# EasyEDA Pro project ProPrj_浇水6代-v2_2026-10-01.epro

# Schematic 上板设计图
Board Name: 上板; Create Date: 2026-09-16; Page Name: P1; Project Name: New Project_2026-09-16_17-24-28; Schematic Name: 上板设计图; Update Date: 2026-09-22; Company: 嘉立创EDA; Page Size: A4; Version: V1.0
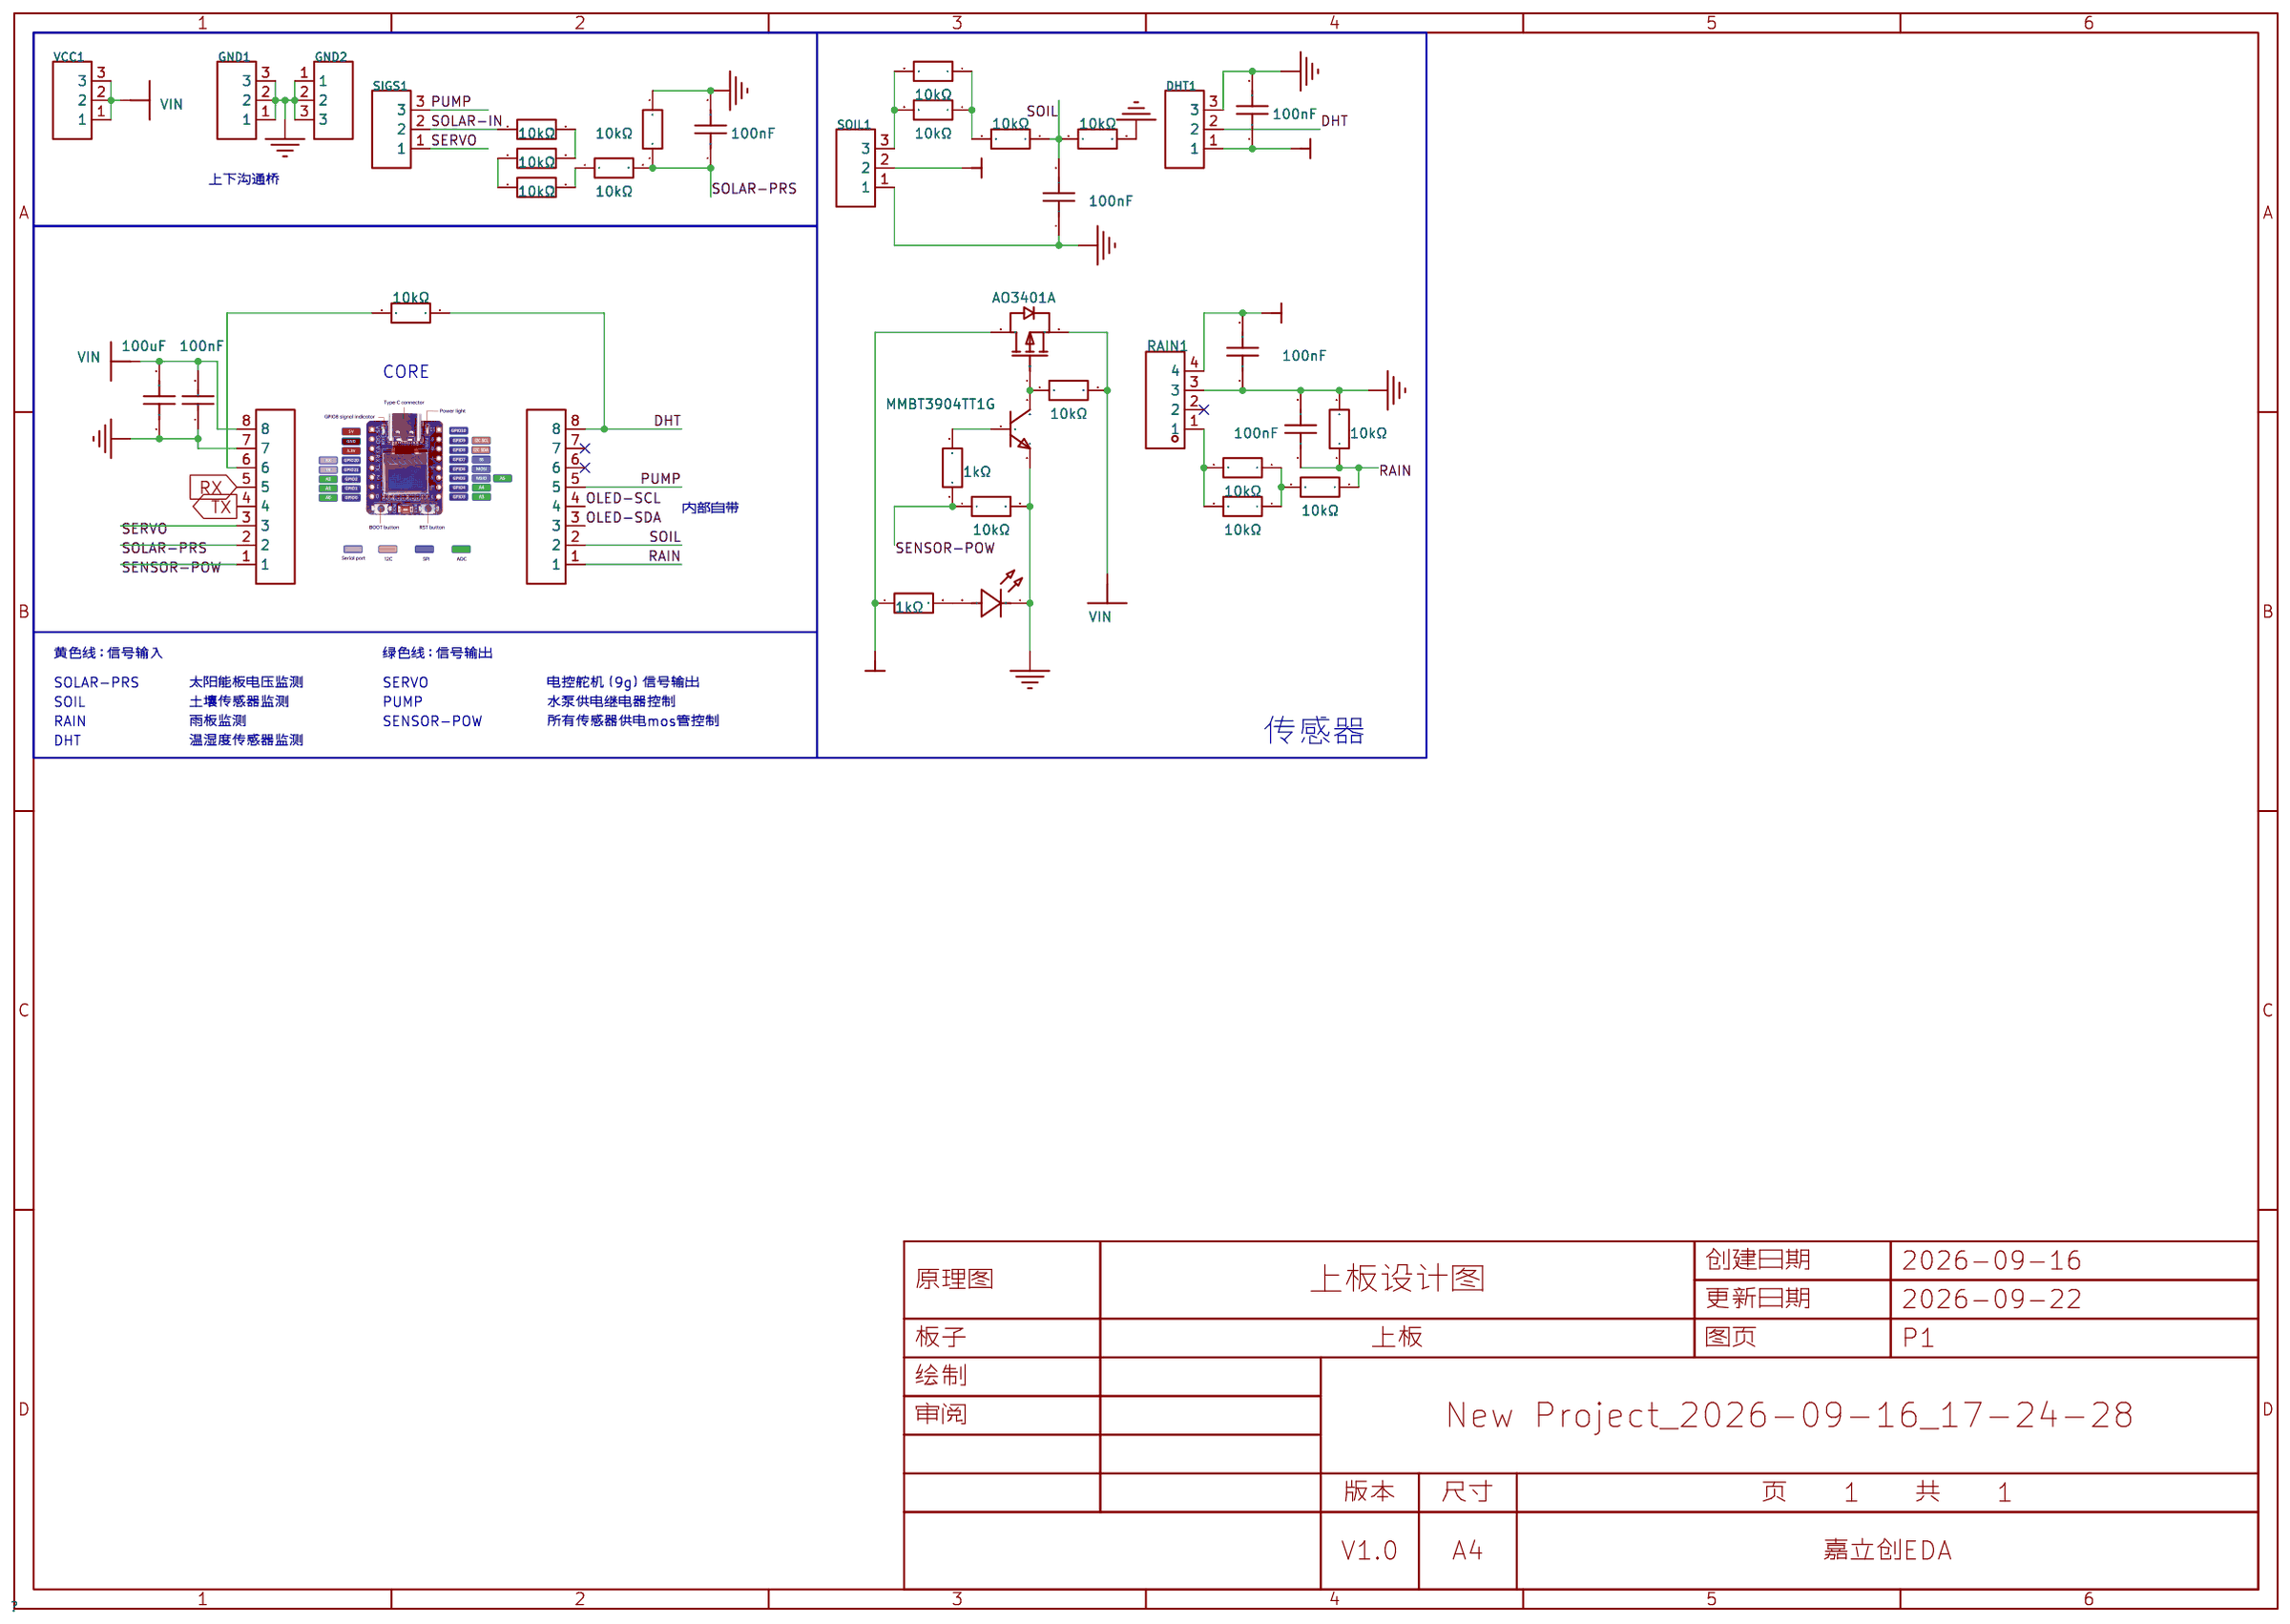
[diagram p0: schematic sheet]

## Parts
C1  100nF  [C0603]
C2  100nF  [C0603]
C28  2.54-1*8P母环保  [HDR-TH_8P-P2.54-V-F]
C29  2.54-1*8P母环保  [HDR-TH_8P-P2.54-V-F]
C31  100uF  [C1206]
C35  100nF  [C0603]
C36  100nF  [C0603]
C37  100nF  [C0603]
C38  100nF  [C0603]
DHT1  LAIL-PZ2.54-3P-L  [HDR-TH_3P-P2.54-V-M-1]
GND1  LAIL-PZ2.54-3P-L  [HDR-TH_3P-P2.54-V-M-1]
GND2  LAIL-PZ2.54-3P-L  [HDR-TH_3P-P2.54-V-M-1]
LED7  XL-2012UGC  [LED0805-RD_GREEN]
Q11  MMBT3904TT1G  [SC-75-3_L1.6-W0.8-P1.00-LS1.6-BR]
Q12  AO3401A  [SOT-23_L2.9-W1.3-P1.90-LS2.4-BR]
R1  1kΩ  [R0603]
R2  1kΩ  [R0603]
R49  10kΩ  [R0603]
R57  10kΩ  [R0603]
R61  10kΩ  [R0603]
R63  10kΩ  [R0603]
R64  10kΩ  [R0603]
R75  10kΩ  [R0603]
R78  10kΩ  [R0603]
R79  10kΩ  [R0603]
R80  10kΩ  [R0603]
R83  10kΩ  [R0603]
R84  10kΩ  [R0603]
R85  10kΩ  [R0603]
R86  10kΩ  [R0603]
R87  10kΩ  [R0603]
R89  10kΩ  [R0603]
R90  10kΩ  [R0603]
RAIN1  PM254-1-04-W-8.5  [HDR-TH_4P-P2.54-H-F-W10.0-N]
SIGS1  LAIL-PZ2.54-3P-L  [HDR-TH_3P-P2.54-V-M-1]
SOIL1  LAIL-PZ2.54-3P-L  [HDR-TH_3P-P2.54-V-M-1]
VCC1  LAIL-PZ2.54-3P-L  [HDR-TH_3P-P2.54-V-M-1]

## Library data of the parts
C1 = CL10B104KO8NNNC: LCSC Part Name: 100nF ±10% 16V; Supplier Part: C66501; Manufacturer: SAMSUNG(三星); Supplier Footprint: 0603; JLCPCB Part Class: Extended Part; Datasheet: https://item.szlcsc.com/datasheet/CL10B104KO8NNNC/67585.html; Supplier: LCSC; Tolerance: ±10%; Voltage Rating: 16V; Temperature Coefficient: X7R
C2 = CL10B104KB8NNNC: 容值:100nF;精度:±10%;额定电压:50V;温度系数:X7R;; LCSC Part Name: 100nF ±10% 50V; Supplier Part: C1591; Manufacturer: SAMSUNG(三星); Supplier Footprint: 0603; JLCPCB Part Class: 扩展库; Datasheet: https://item.szlcsc.com/datasheet/CL10B104KB8NNNC/1943.html; Supplier: LCSC; Tolerance: ±10%; Voltage Rating: 50V; Temperature Coefficient: X7R
C28 C29 = 2.54-1*8P母环保: LCSC Part Name: 1x8P 间距:2.54mm 直插; Supplier Part: C27438; Manufacturer: BOOMELE(博穆精密); Supplier Footprint: 插件,P=2.54mm; JLCPCB Part Class: 扩展库; Datasheet: https://item.szlcsc.com/datasheet/2.54-1*8P%25E6%25AF%258D%25E7%258E%25AF%25E4%25BF%259D/28187.html; Supplier: LCSC; Holes Structure: 1x8P; Pitch: 2.54mm; Circular Hole / Square Hole: 方孔; Mounting Type: 直插; Number of Rows: 单排; Number of Positions: 8P; Current Rating: 3A; Holes Direction: 顶部; Insulation Height: 8.5mm; Contact Material: 黄铜; Contact Plating: 金; Operating Temperature: -55℃~+105℃; PIN Length: 3.2mm
C31 = JMK316BJ107ML-T: LCSC Part Name: 100uF ±20% 6.3V; Supplier Part: C87164; Manufacturer: TAIYO YUDEN(太诱); Supplier Footprint: 1206; JLCPCB Part Class: Extended Part; Datasheet: https://atta.szlcsc.com/upload/public/pdf/source/20161110/1478747674498.pdf; Supplier: LCSC; Tolerance: ±20%; Voltage Rated: 6.3V; Temperature Coefficient: X5R
C35-C38 = CL10B104KB8NNNC: LCSC Part Name: 100nF ±10% 50V; Supplier Part: C1591; Manufacturer: SAMSUNG(三星); Supplier Footprint: 0603; JLCPCB Part Class: 扩展库; Datasheet: https://item.szlcsc.com/datasheet/CL10B104KB8NNNC/1943.html; Supplier: LCSC; Tolerance: ±10%; Voltage Rating: 50V; Temperature Coefficient: X7R
DHT1 GND1 SIGS1 SOIL1 VCC1 = LAIL-PZ2.54-3P-L: LCSC Part Name: 1x3P 间距:2.54mm 方针; Supplier Part: C54950604; Manufacturer: LAILAN(莱联); Supplier Footprint: 插件,P=2.54mm; JLCPCB Part Class: 扩展库; Datasheet: https://item.szlcsc.com/datasheet/LAIL-PZ2.54-3P-L/58519957.html; Supplier: LCSC; Pin Structure: 1x3P; Pitch: 2.54mm; Circluar Pins/Square Pins: 方针; Number of Rows: 单排; Number of Pins: 3P; Current Rating: 3A; Voltage Rating (Max): 250V; Insulation Height: 2.5mm; Length of End Connection Pin: 3mm; Contact Material: 黄铜; Contact Plating: 金; Operating Temperature: -25℃~+80℃; Color: 黑色
GND2 = LAIL-PZ2.54-3P-L: 插针结构:1x3P;间距:2.54mm;圆针/方针:方针;排数:单排;总PIN位数:3P;额定电流:3A;额定电压:250V;塑高:2.5mm;端接针长度:3mm;触头材质:黄铜;触头镀层:金;工作温度:-25℃~+80℃;颜色:黑色;; LCSC Part Name: 1x3P 间距:2.54mm 方针; Supplier Part: C54950604; Manufacturer: LAILAN(莱联); Supplier Footprint: 插件,P=2.54mm; JLCPCB Part Class: 扩展库; Datasheet: https://item.szlcsc.com/datasheet/LAIL-PZ2.54-3P-L/58519957.html; Supplier: LCSC; Pin Structure: 1x3P; Pitch: 2.54mm; Circluar Pins/Square Pins: 方针; Number of Rows: 单排; Number of Pins: 3P; Current Rating: 3A; Voltage Rating (Max): 250V; Insulation Height: 2.5mm; Length of End Connection Pin: 3mm; Contact Material: 黄铜; Contact Plating: 金; Operating Temperature: -25℃~+80℃; Color: 黑色
LED7 = XL-2012UGC: LCSC Part Name: 0805翠绿贴片式发光二极管; Supplier Part: C965815; Manufacturer: XINGLIGHT(成兴光); Supplier Footprint: 0805; JLCPCB Part Class: 扩展库; Datasheet: https://item.szlcsc.com/datasheet/XL-2012UGC/1051424.html; Supplier: LCSC; Lamp Holder Type: 2.0mmx1.2mm方形灯头; Illumination Color: 翠绿色; Voltage - Forward(Vf): 3.2V; Power(Watts): 70mW; Forward Current: 20mA; Wavelength - Dominant: 515nm~535nm; Peak Wavelength: 525nm; Diode Configuration: 独立二极管; Lens Color: 无色透明透镜; Luminous Intensity: 750mcd; Viewing Angle: 120°; Mounting Style: 正贴; Operating Temperature: -40℃~+85℃
Q11 = MMBT3904TT1G: LCSC Part Name: NPN 电流:200mA 电压:40V; Supplier Part: C242260; Manufacturer: onsemi(安森美); Supplier Footprint: SOT-416; JLCPCB Part Class: 扩展库; Datasheet: https://item.szlcsc.com/datasheet/MMBT3904TT1G/241201.html; Supplier: LCSC; type: NPN; Current - Collector(Ic): 200mA; Collector - Emitter Voltage VCEO: 40V; Pd - Power Dissipation: 200mW; DC Current Gain: 100@0.1mA,1.0V; Transition frequency(fT): 300MHz; Current - Collector Cutoff: 50nA; Vce Saturation(VCE(sat)): 300mV@10mA,5mA; Operating Temperature: -65℃~+150℃; Emitter-Base Voltage(Vebo): 6V; Number: 1个NPN
Q12 = AO3401A_C15127: LCSC Part Name: 1个P沟道 耐压:30V 电流:4A; Supplier Part: C15127; Manufacturer: AOS; Supplier Footprint: SOT-23; JLCPCB Part Class: 基础库; Datasheet: https://item.szlcsc.com/datasheet/AO3401A/15801.html; Supplier: LCSC; Number: 1个P沟道; Drain to Source Voltage: 30V; Current - Continuous Drain(Id): 4A; RDS(on): 47mΩ@10V；85mΩ@2.5V；60mΩ@4.5V; Gate Threshold Voltage (Vgs(th)): 900mV; Gate Charge(Qg): 14nC@10V; Input Capacitance(Ciss): 645pF; Reverse Transfer Capacitance (Crss@Vds): 55pF; Output Capacitance(Coss): 80pF
R1 R2 = FRC0603F1001TS: 电阻类型:厚膜电阻;阻值:1kΩ;精度:±1%;功率:100mW;工作电压:75V;温度系数:±100ppm/℃;; LCSC Part Name: 1kΩ ±1% 100mW 厚膜电阻; Supplier Part: C2907002; Manufacturer: FOJAN(富捷); Supplier Footprint: 0603; JLCPCB Part Class: 扩展库; Datasheet: https://item.szlcsc.com/datasheet/FRC0603F1001TS/3180515.html; Supplier: LCSC; Type: 厚膜电阻; Tolerance: ±1%; Power(Watts): 100mW; Voltage-Supply(Max): 75V; Temperature Coefficient: ±100ppm/℃; Operating Temperature: -55℃~+155℃
R49 R57 R61 R63 R64 R80 R83-R87 R89 R90 = FRC0603F1002TS: LCSC Part Name: 10kΩ ±1% 100mW 厚膜电阻; Supplier Part: C2906982; Manufacturer: FOJAN(富捷); Supplier Footprint: 0603; JLCPCB Part Class: 扩展库; Datasheet: https://item.szlcsc.com/datasheet/FRC0603F1002TS/3180495.html; Supplier: LCSC; Type: 厚膜电阻; Tolerance: ±1%; Power(Watts): 100mW; Voltage-Supply(Max): 75V; Temperature Coefficient: ±100ppm/℃; Operating Temperature: -55℃~+155℃
R75 R78 R79 = FRC0603J103 TS: LCSC Part Name: 10kΩ ±5% 100mW 厚膜电阻; Supplier Part: C2930027; Manufacturer: FOJAN(富捷); Supplier Footprint: 0603; JLCPCB Part Class: 扩展库; Datasheet: https://item.szlcsc.com/datasheet/FRC0603J103%2520TS/3266960.html; Supplier: LCSC; Type: 厚膜电阻; Tolerance: ±5%; Power(Watts): 100mW; Voltage-Supply(Max): 75V; Temperature Coefficient: ±100ppm/℃; Operating Temperature: -55℃~+155℃
RAIN1 = PM254-1-04-W-8.5: LCSC Part Name: 1x4P 间距:2.54mm 弯插; Supplier Part: C2897386; Manufacturer: HCTL(华灿天禄); Supplier Footprint: 弯插,P=2.54mm; JLCPCB Part Class: 扩展库; Datasheet: https://item.szlcsc.com/datasheet/PM254-1-04-W-8.5/3142391.html; Supplier: LCSC; Holes Structure: 1x4P; Pitch: 2.54mm; Circular Hole / Square Hole: 方孔; Mounting Type: 弯插; Number of Rows: 单排; Number of Positions: 4P; Current Rating: 3A; Holes Direction: 侧面; Insulation Height: 8.5mm; Contact Material: 铜合金; Operating Temperature: -40℃~+105℃

## Nets
GND: C1.1 C2.1 C29.7 C31.1 C35.2 C36.2 C37.2 C38.1 DHT1.3 GND1.1 GND1.2 GND1.3 GND2.1 GND2.2 GND2.3 LED7.1(K) Q11.2(E) R61.2 R78.2 R83.2 R85.2 RAIN1.3 SOIL1.1
VIN: C1.2 C29.8 C31.2 Q12.2(S) R79.2 VCC1.1 VCC1.2 VCC1.3
CTR-PWR: C2.2 C35.1 DHT1.1 Q12.3(D) R2.1 RAIN1.4 SOIL1.2
DHT: C28.8 DHT1.2 R75.1
OLED-SCL: C28.4
OLED-SDA: C28.3
PUMP: C28.5 SIGS1.3
RAIN: C28.1 C36.1 R85.1 R87.1
RX: C29.5
SENSOR-POW: C29.1 R1.1 R78.1
SERVO: C29.3 SIGS1.1
SOIL: C28.2 C38.2 R80.1 R83.1
SOLAR-IN: R49.1 SIGS1.2
SOLAR-PRS: C29.2 C37.1 R61.1 R64.2
TX: C29.4
$1N3086: R49.2 R57.2
$1N3441: R63.2 R64.1
$1N3489: R57.1 R63.1
$1N5191: C29.6 R75.2
$1N5883: Q11.1(B) R1.2
$1N5886: Q11.3(C) Q12.1(G) R79.1
$1N6540: R84.2 R86.2 RAIN1.1
$1N8864: R84.1 R86.1 R87.2
$1N8994: R89.2 R90.2 SOIL1.3
$1N9000: R80.2 R89.1 R90.1
$1N9001: LED7.2(A) R2.2

Not connected (* = marked no-connect by the designer): C28 6* 7*; RAIN1 2*

## Notes on the sheet
- 上下沟通桥
- CORE
- 内部自带
- 黄色线：信号输入
- 绿色线：信号输出
- SOIL
- SOLAR-PRS
- 土壤传感器监测
- 太阳能板电压监测
- PUMP
- SERVO
- 水泵供电继电器控制
- 电控舵机（9g）信号输出
- RAIN
- 雨板监测
- SENSOR-POW
- 所有传感器供电mos管控制
- DHT
- 温湿度传感器监测
- 传感器

# Schematic 下板设计图
Board Name: 下板; Create Date: 2026-09-21; Page Name: P1; Project Name: New Project_2026-09-16_17-24-28; Schematic Name: 下板设计图; Update Date: 2026-09-22; Company: 嘉立创EDA; Page Size: A4; Version: V1.0
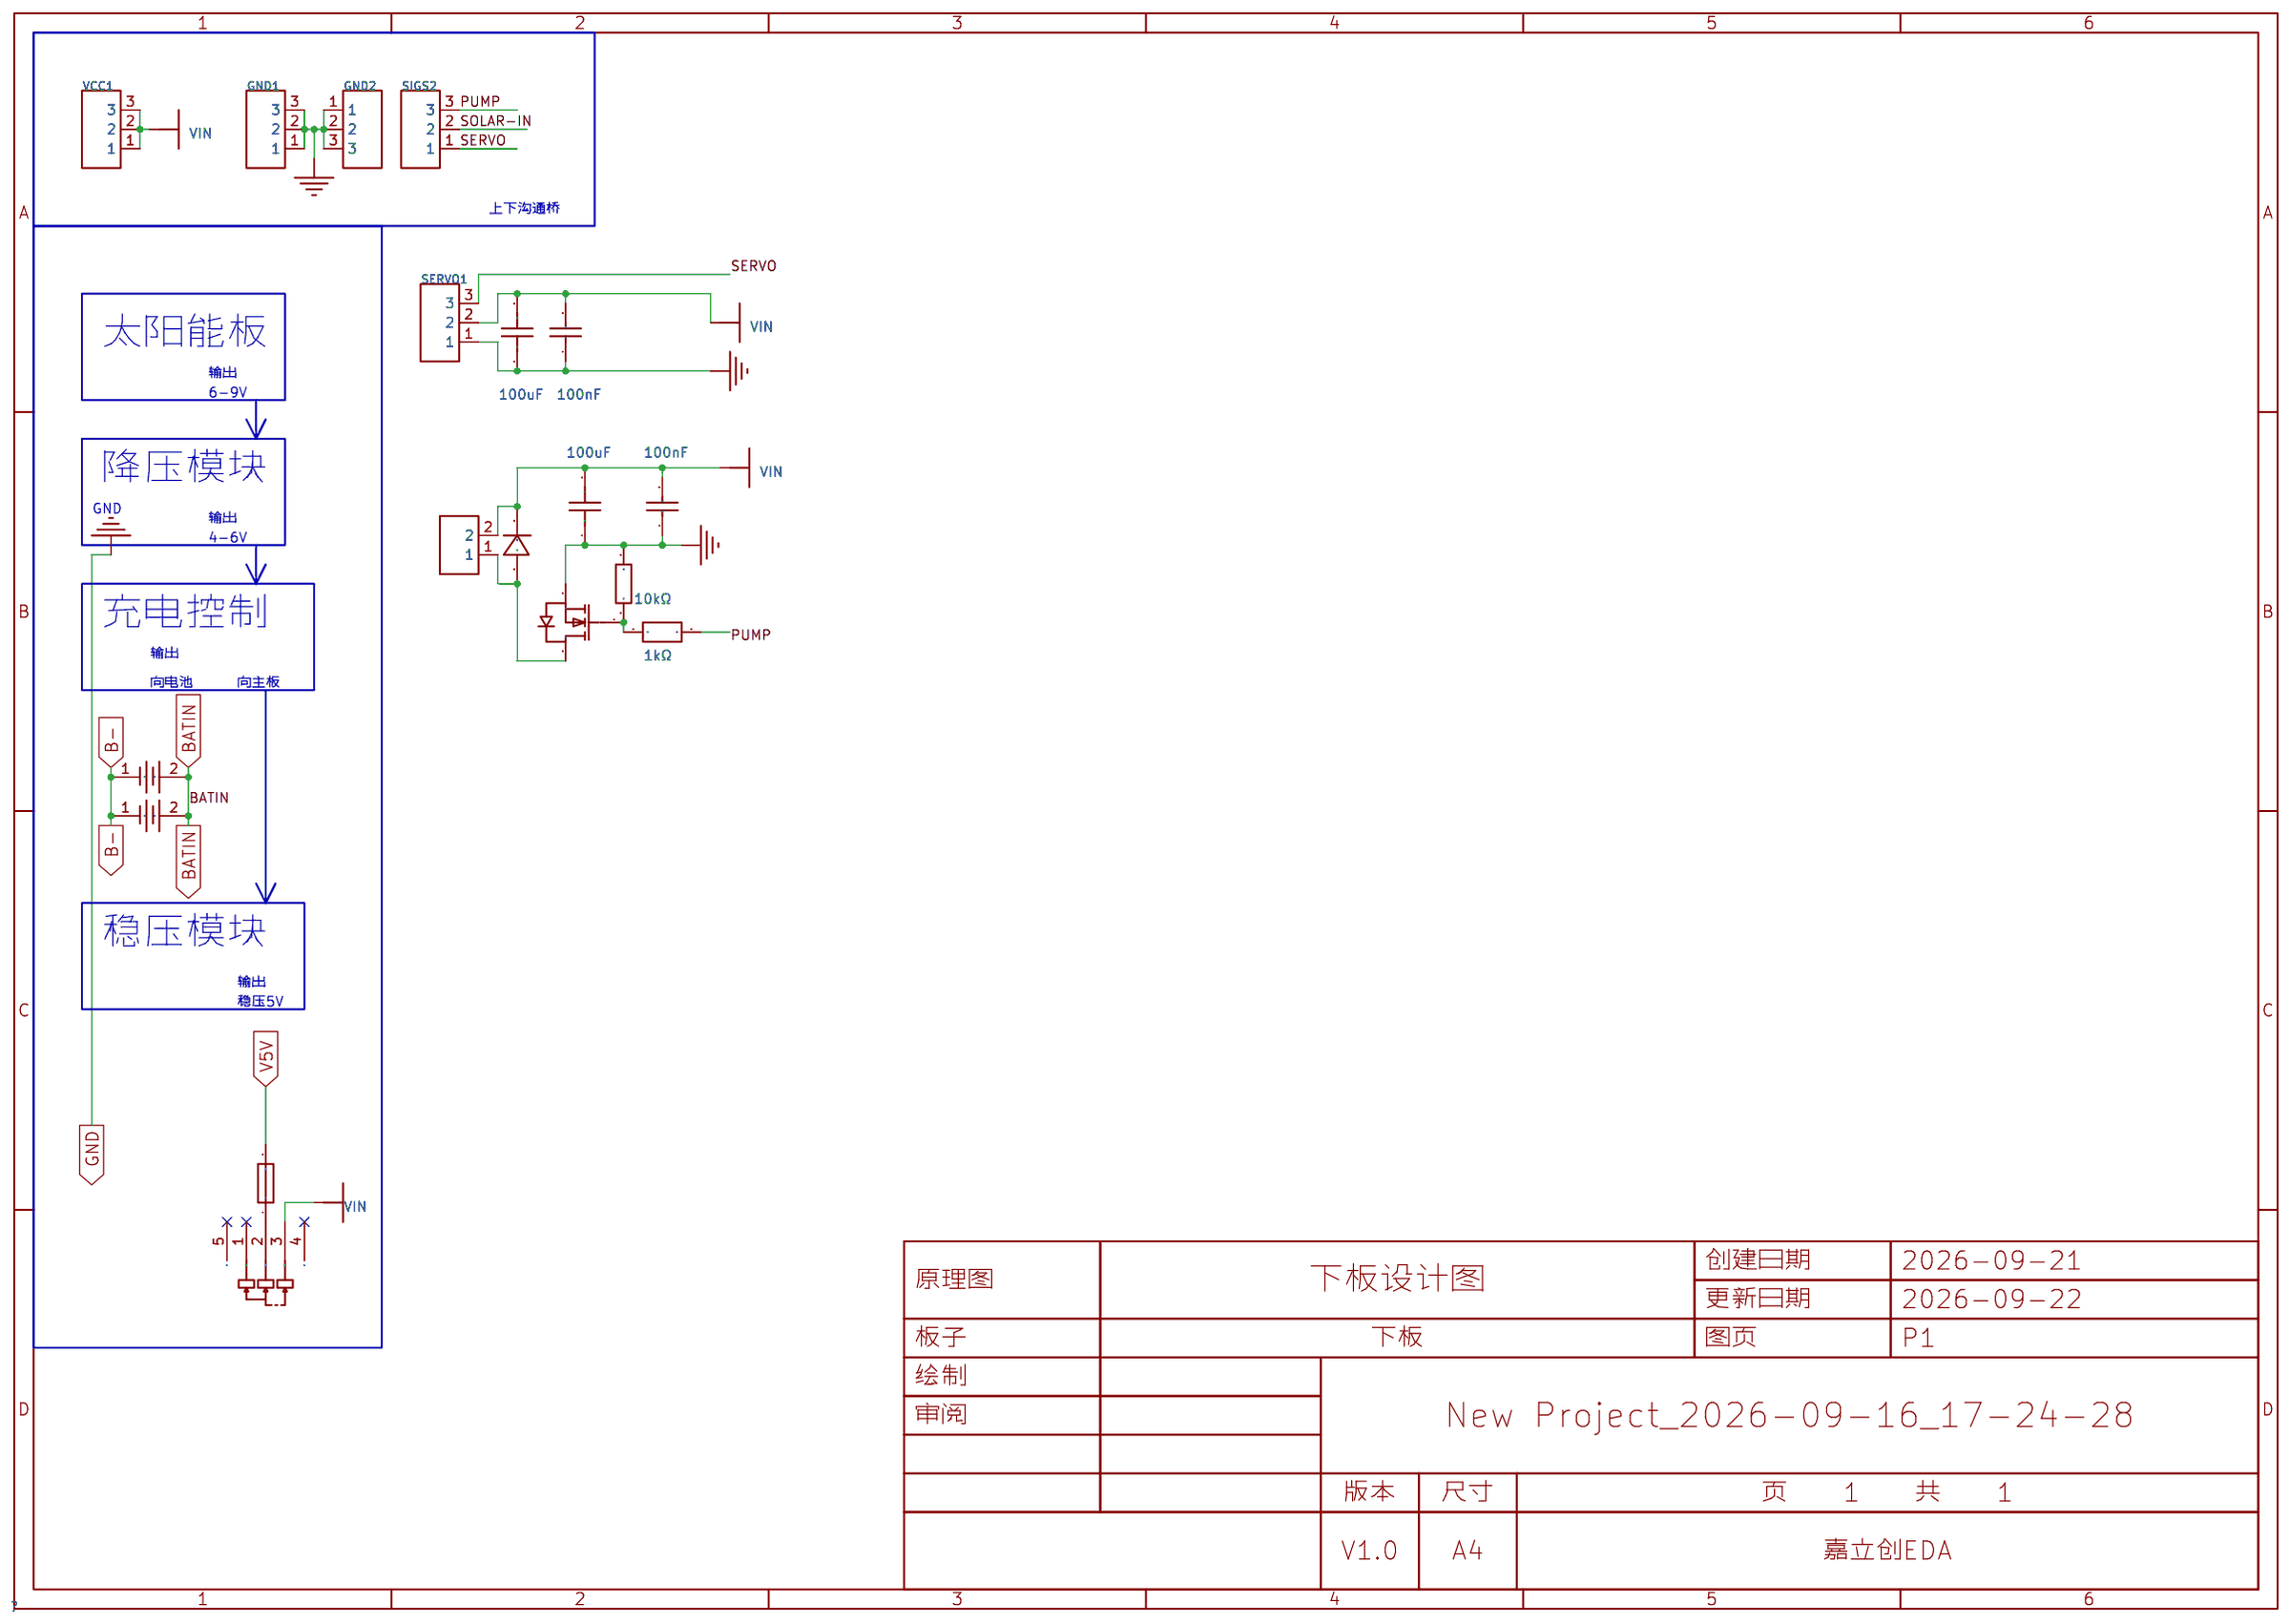
[diagram p1: schematic sheet]

## Parts
C1  100nF  [C0603]
C2  100nF  [C0603]
C12  100uF  [C1206]
C31  100uF  [C1206]
D3  1N4007RLG  [DO-41_BD2.4-L4.7-P8.70-D0.9-RD]
F1  SMD1206-300-6  [F1206]
GND1  LAIL-PM2.54-3P-L  [HDR-TH_3P-P2.54-V-F]
GND2  LAIL-PM2.54-3P-L  [HDR-TH_3P-P2.54-V-F]
H3  PZ200V-11-02P  [HDR-TH_2P-P2.00-V-M]
Q7  AO3400A  [SOT-23-3_L2.9-W1.3-P1.90-LS2.4-BR]
R1  1kΩ  [R0603]
R17  10kΩ  [R1206]
SERVO1  LAIL-PZ2.54-3P-L  [HDR-TH_3P-P2.54-V-M-1]
SIGS2  LAIL-PM2.54-3P-L  [HDR-TH_3P-P2.54-V-F]
SW1  SK12D07VG5  [SW-TH_SK12D07VG5-1]
U1  BH-18650-A6AJ012  [BAT-TH_BH-18650-A6AJ012]
U2  BH-18650-A6AJ012  [BAT-TH_BH-18650-A6AJ012]
VCC1  LAIL-PM2.54-3P-L  [HDR-TH_3P-P2.54-V-F]

## Library data of the parts
C1 C2 = CL10B104KO8NNNC: LCSC Part Name: 100nF ±10% 16V; Supplier Part: C66501; Manufacturer: SAMSUNG(三星); Supplier Footprint: 0603; JLCPCB Part Class: Extended Part; Datasheet: https://item.szlcsc.com/datasheet/CL10B104KO8NNNC/67585.html; Supplier: LCSC; Tolerance: ±10%; Voltage Rating: 16V; Temperature Coefficient: X7R
C12 C31 = JMK316BJ107ML-T: LCSC Part Name: 100uF ±20% 6.3V; Supplier Part: C87164; Manufacturer: TAIYO YUDEN(太诱); Supplier Footprint: 1206; JLCPCB Part Class: Extended Part; Datasheet: https://atta.szlcsc.com/upload/public/pdf/source/20161110/1478747674498.pdf; Supplier: LCSC; Tolerance: ±20%; Voltage Rated: 6.3V; Temperature Coefficient: X5R
D3 = 1N4007RLG: LCSC Part Name: 1kV 1A; Supplier Part: C53568; Manufacturer: onsemi(安森美); Supplier Footprint: DO-41; JLCPCB Part Class: 扩展库; Datasheet: https://item.szlcsc.com/datasheet/1N4007RLG/54584.html; Supplier: LCSC; Voltage - Forward(Vf@If): 930mV@1A; Voltage - DC Reverse(Vr): 1kV; Current - Rectified: 1A; Reverse Leakage Current (Ir): 50nA@1kV; Non-Repetitive Peak Forward Surge Current: 30A; Operating Junction Temperature Range: -65℃~+175℃
F1 = SMD1206-300-6: LCSC Part Name: 6V 3A; Supplier Part: C46641035; Manufacturer: R+O(宏嘉诚); Supplier Footprint: 1206; JLCPCB Part Class: 扩展库; Datasheet: https://item.szlcsc.com/datasheet/SMD1206-300-6/48798741.html; Supplier: LCSC; Voltage - Max: 6V; Current - Max: 40A; Hold Current: 3A; Trip Current: 6A; Power Dissipation: 1W; Resistance - Initial (Ri) (Min): 10mΩ; Resistance - Post Trip (R1) (Max): 50mΩ; Time to Trip(Max): 4s; Operating Temperature: -40℃~+85℃; Length: 3.6mm; Width: 1.9mm; Height: 1.6mm
GND1 SIGS2 VCC1 = LAIL-PM2.54-3P-L: LCSC Part Name: 1x3P 间距:2.54mm 直插; Supplier Part: C54973828; Manufacturer: LAILAN(莱联); Supplier Footprint: 插件,P=2.54mm; JLCPCB Part Class: 扩展库; Datasheet: https://item.szlcsc.com/datasheet/LAIL-PM2.54-3P-L/58554906.html; Supplier: LCSC; Holes Structure: 1x3P; Pitch: 2.54mm; Circular Hole / Square Hole: 方孔; Mounting Type: 直插; Number of Rows: 单排; Number of Positions: 3P; Current Rating: 3A; Voltage Rating (Max): 250V; Holes Direction: 顶部; Insulation Height: 8.5mm; Contact Material: 黄铜; Contact Plating: 金; Operating Temperature: -25℃~+80℃; PIN Length: 3mm
GND2 = LAIL-PM2.54-3P-L: 插孔结构:1x3P;间距:2.54mm;圆孔/方孔:方孔;安装方式:直插;排数:单排;总孔位数:3P;额定电流:3A;额定电压:250V;插孔方向:顶部;塑高:8.5mm;触头材质:黄铜;触头镀层:金;工作温度:-25℃~+80℃;; LCSC Part Name: 1x3P 间距:2.54mm 直插; Supplier Part: C54973828; Manufacturer: LAILAN(莱联); Supplier Footprint: 插件,P=2.54mm; JLCPCB Part Class: 扩展库; Datasheet: https://item.szlcsc.com/datasheet/LAIL-PM2.54-3P-L/58554906.html; Supplier: LCSC; Holes Structure: 1x3P; Pitch: 2.54mm; Circular Hole / Square Hole: 方孔; Mounting Type: 直插; Number of Rows: 单排; Number of Positions: 3P; Current Rating: 3A; Voltage Rating (Max): 250V; Holes Direction: 顶部; Insulation Height: 8.5mm; Contact Material: 黄铜; Contact Plating: 金; Operating Temperature: -25℃~+80℃; PIN Length: 3mm
H3 = PZ200V-11-02P: LCSC Part Name: 1x2P 间距:2mm 方针 直插; Supplier Part: C541856; Manufacturer: XFCN(兴飞); Supplier Footprint: 插件,P=2mm; JLCPCB Part Class: 扩展库; Datasheet: https://item.szlcsc.com/datasheet/PZ200V-11-02P/562477.html; Supplier: LCSC; Pin Structure: 1x2P; Pitch: 2mm; Circluar Pins/Square Pins: 方针; Mounting Type: 直插; Number of Rows: 单排; Number of Pins: 2P; Current Rating: 1.5A; Voltage Rating (Max): 250V; Length of Mating Pin: 3.9mm; Insulation Height: 2mm; Length of End Connection Pin: 2.8mm; Contact Material: 黄铜; Operating Temperature: -40℃~+105℃; Color: 黑色
Q7 = AO3400A_C20917: LCSC Part Name: 1个N沟道 耐压:30V 电流:5.7A; Supplier Part: C20917; Manufacturer: AOS; Supplier Footprint: SOT-23-3L; JLCPCB Part Class: 基础库; Datasheet: https://item.szlcsc.com/datasheet/AO3400A/21629.html; Supplier: LCSC; Drain to Source Voltage: 30V; RDS(on): 48mΩ@2.5V; Gate Threshold Voltage (Vgs(th)): 1.45V@250uA; Gate Charge(Qg): 7nC@10V; Input Capacitance(Ciss): 630pF@15V; Operating Temperature: -55℃~+150℃@(Tj); Type: N沟道
R1 = FRC0603F1001TS: 电阻类型:厚膜电阻;阻值:1kΩ;精度:±1%;功率:100mW;工作电压:75V;温度系数:±100ppm/℃;; LCSC Part Name: 1kΩ ±1% 100mW 厚膜电阻; Supplier Part: C2907002; Manufacturer: FOJAN(富捷); Supplier Footprint: 0603; JLCPCB Part Class: 扩展库; Datasheet: https://item.szlcsc.com/datasheet/FRC0603F1001TS/3180515.html; Supplier: LCSC; Type: 厚膜电阻; Tolerance: ±1%; Power(Watts): 100mW; Voltage-Supply(Max): 75V; Temperature Coefficient: ±100ppm/℃; Operating Temperature: -55℃~+155℃
R17 = 1206W4F1002T5E: LCSC Part Name: 10kΩ ±1% 250mW 厚膜电阻; Supplier Part: C17902; Manufacturer: UNI-ROYAL(厚声); Supplier Footprint: 1206; JLCPCB Part Class: 基础库; Datasheet: https://item.szlcsc.com/datasheet/1206W4F1002T5E/18590.html; Supplier: LCSC; Type: 厚膜电阻; Tolerance: ±1%; Power(Watts): 250mW; Voltage-Supply(Max): 200V; Temperature Coefficient: ±100ppm/℃; Operating Temperature: -55℃~+155℃
SERVO1 = LAIL-PZ2.54-3P-L: LCSC Part Name: 1x3P 间距:2.54mm 方针; Supplier Part: C54950604; Manufacturer: LAILAN(莱联); Supplier Footprint: 插件,P=2.54mm; JLCPCB Part Class: 扩展库; Datasheet: https://item.szlcsc.com/datasheet/LAIL-PZ2.54-3P-L/58519957.html; Supplier: LCSC; Pin Structure: 1x3P; Pitch: 2.54mm; Circluar Pins/Square Pins: 方针; Number of Rows: 单排; Number of Pins: 3P; Current Rating: 3A; Voltage Rating (Max): 250V; Insulation Height: 2.5mm; Length of End Connection Pin: 3mm; Contact Material: 黄铜; Contact Plating: 金; Operating Temperature: -25℃~+80℃; Color: 黑色
SW1 = SK12D07VG5: Supplier Part: C431548; Manufacturer: SHOU HAN(首韩); Supplier Footprint: 插件,8.7x4.4mm; JLCPCB Part Class: 扩展库; Datasheet: https://item.szlcsc.com/datasheet/SK12D07VG5/427905.html; Supplier: LCSC; Circuit: 单刀双掷; Termination Style: PC引脚; Length: 8.7mm; Width: 4.4mm; Switch Height: 4.7mm; Current Rating: 500mA; Voltage Rating: 50V; Life: 5千次; Operating Temperature: -10℃~+50℃
U1 U2 = BH-18650-A6AJ012: LCSC Part Name: MYOUNG(美阳)电池盒电池底座BH-18650-1J Ni 卧式DIP带柱 双负极弹片 PA66阻燃 适配18650电池; Supplier Part: C19184084; Manufacturer: MYOUNG(美阳); JLCPCB Part Class: 扩展库; Datasheet: https://item.szlcsc.com/datasheet/BH-18650-A6AJ012/20398490.html; Supplier: LCSC; Type: 电池盒; Operating Temperature: -25~85℃; Contact material: 不锈钢; Contact coating: 镀镍

## Nets
GND: C1.1 C2.1 C12.1 C31.1 GND1.1 GND1.2 GND1.3 GND2.1 GND2.2 GND2.3 Q7.2(S) R17.1 SERVO1.1
V5V: F1.2
VIN: C1.2 C2.2 C12.2 C31.2 D3.1(C) H3.2 SERVO1.2 SW1.3 VCC1.1 VCC1.2 VCC1.3
B-: U1.1 U2.1
BATIN: U1.2 U2.2
PUMP: R1.2 SIGS2.3
SERVO: SERVO1.3 SIGS2.1
SOLAR-IN: SIGS2.2
$1N1444: F1.1 SW1.2
$1N2742: D3.2(A) H3.1 Q7.3(D)
$1N2960: Q7.1(G) R1.1 R17.2

Not connected (* = marked no-connect by the designer): SW1 1* 4* 5*

## Notes on the sheet
- 上下沟通桥
- 太阳能板
- 输出
- 6-9V
- 降压模块
- GND
- 输出
- 4-6V
- 充电控制
- 输出
- 向电池
- 向主板
- 稳压模块
- 输出
- 稳压5V

# Board PCB1
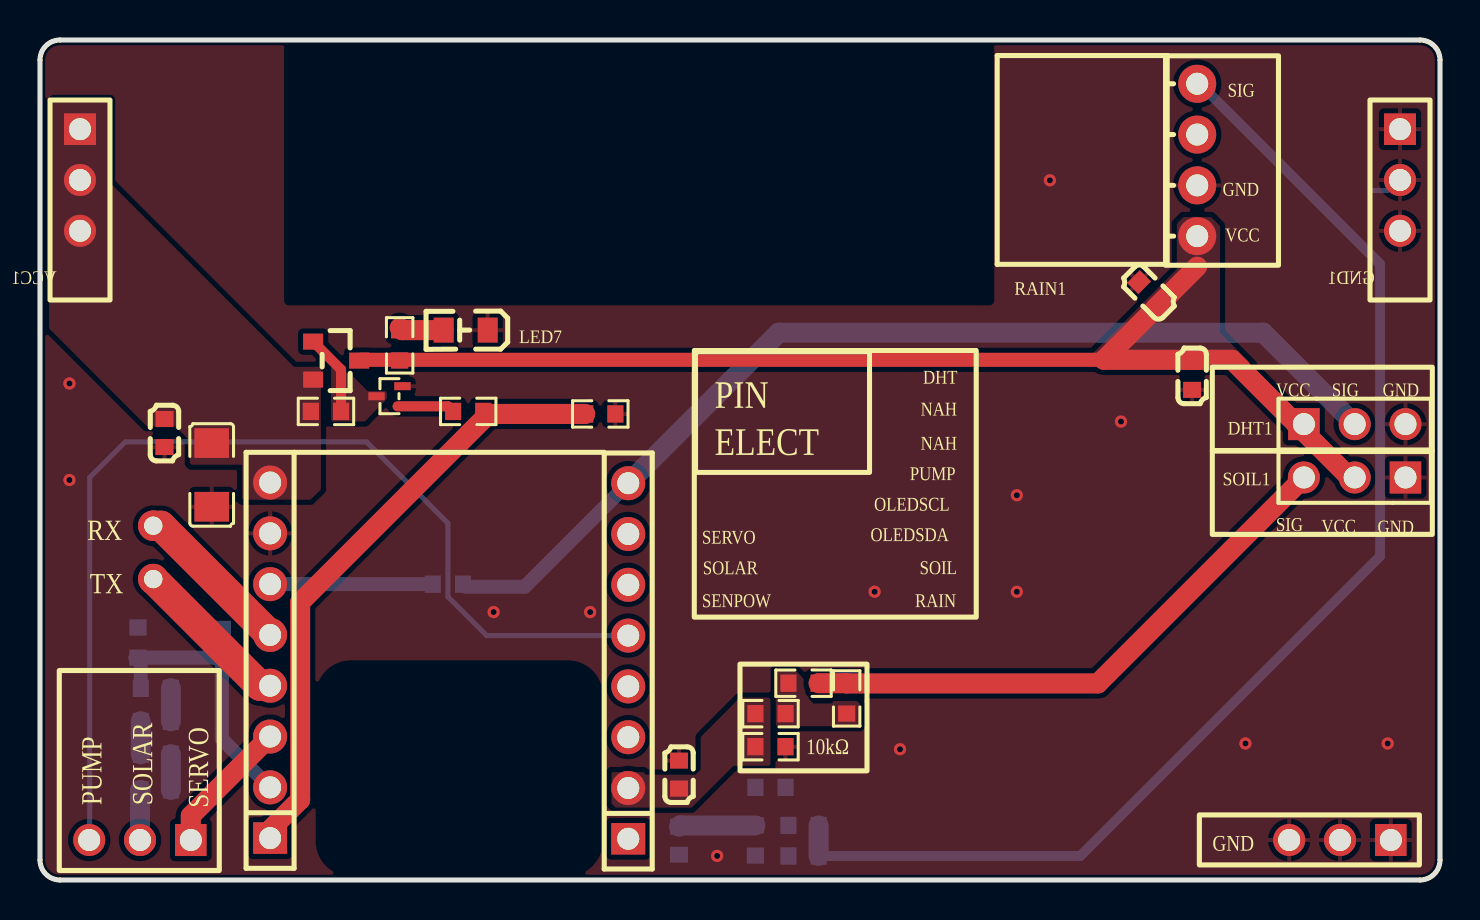
[diagram p2: board, top side]
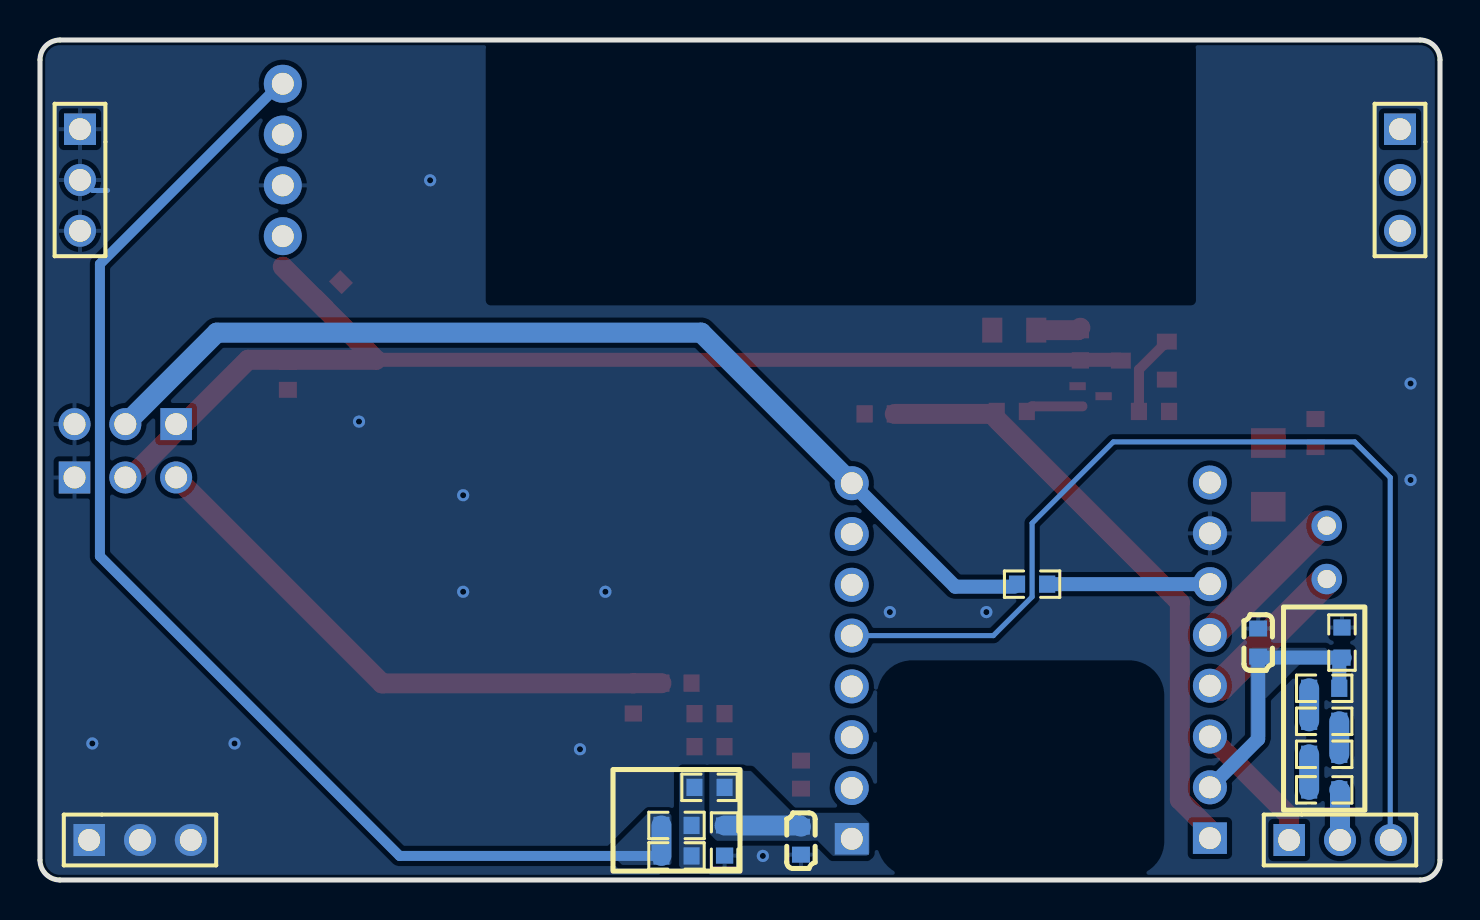
[diagram p3: board, bottom side, seen from below]

Outline 70 x 42 mm; copper layers: Top Layer, Bottom Layer. Coordinates in mm from the lower left corner of the outline.
Outline path: 0,41 0,1 arc(0.29,0.29) 1,0 69,0 arc(69.71,0.29) 70,1 70,41 arc(69.71,41.71) 69,42 1,42 arc(0.29,41.71) 0,41
Stack: Top Layer 0.035mm / Dielectric1 1.51mm FR4 er 4.5 / Bottom Layer 0.035mm

## Design rules (mm)
spacing copperThickness1oz (default): track to track 0.102, other pairs 0.152 to 0.3
spacing copperThickness2oz: track to track 0.203, other pairs 0.152 to 0.3
spacing Plane_innerPlane: track to track 0.102, other pairs 0.152 to 0.3
spacing Copper_copperRegion: track to track 0.102, other pairs 0.152 to 0.3
spacing Copper_无限制: track to track 0.102, other pairs 0.152 to 0.3
spacing Copper_copperRegion_copperThickness1oz: track to track 0.102, other pairs 0.152 to 0.3
spacing Copper_copperRegion_Copper_无限制: track to track 0.102, other pairs 0.152 to 0.3
spacing Copper_copperRegion_Copper_copperRegion: track to track 0.102, other pairs 0.152 to 0.3
track width copperThickness1oz (default): min 0.127, default 0.254, max 2.54
track width copperThickness2oz: min 0.203, default 0.254, max 2.54
differential pair differentialPair (default): width min 0.127, default 0.254, max 2.54; gap min 0.152, default 0.152
via viaSize (default): diameter min 0.5, default 0.61, max 10; hole min 0.3, default 0.305, max 6.3
net SOIL uses 无限制_copperThickness1oz
net RAIN uses 无限制_copperThickness1oz
net VIN uses 无限制_copperThickness1oz
net GND uses copperRegion_copperThickness1oz
net SOLAR-PRS uses 无限制_copperThickness1oz
net CTR-PWR uses 无限制_copperThickness1oz
net $1N5886 uses 无限制_copperThickness1oz
net $1N6540 uses 无限制_copperThickness1oz
net $1N9000 uses 无限制_copperThickness1oz
net $1N8864 uses 无限制_copperThickness1oz
pour e105 uses Copper_无限制, copperRegion_Copper_无限制
pour e107 uses Copper_copperRegion_Copper_无限制, 无限制_Copper_copperRegion_Copper_无限制
pour e109 uses Copper_无限制, copperRegion_Copper_无限制
pour e111 uses Copper_无限制, copperRegion_Copper_无限制
pour e113 uses Copper_无限制, copperRegion_Copper_无限制
pour e115 uses Copper_无限制, copperRegion_Copper_无限制
pour e116 uses Copper_copperRegion_Copper_无限制, 无限制_Copper_copperRegion_Copper_无限制
pour e118 uses Copper_无限制, copperRegion_Copper_无限制
pour e120 uses Copper_无限制, copperRegion_Copper_无限制
pour e122 uses Copper_无限制, copperRegion_Copper_无限制
pour e124 uses Copper_无限制, copperRegion_Copper_无限制
pour e126 uses Copper_无限制, copperRegion_Copper_无限制
pour e128 uses Copper_copperRegion, copperRegion_Copper_copperRegion
pour e180 uses Copper_copperRegion, copperRegion_Copper_copperRegion

## Placement (name value [footprint] x y rotation side)
C1  100nF  [C0603]  6.22 22.35 90 top
C2  100nF  [C0603]  55.45 29.4 315 top
C28  2.54-1*8P母环保  [HDR-TH_8P-P2.54-V-F]  29.41 10.95 90 top
C29  2.54-1*8P母环保  [HDR-TH_8P-P2.54-V-F]  11.5 10.98 90 top
C31  100uF  [C1206]  8.58 20.25 90 top
C35  100nF  [C0603]  57.61 25.21 270 top
C36  100nF  [C0603]  31.95 1.97 270 bottom
C37  100nF  [C0603]  9.09 11.87 90 bottom
C38  100nF  [C0603]  31.95 5.27 270 top
DHT1  LAIL-PZ2.54-3P-L  [HDR-TH_3P-P2.54-V-M-1]  65.73 22.79 0 top
GND1  LAIL-PZ2.54-3P-L  [HDR-TH_3P-P2.54-V-M-1]  68 35 270 bottom
GND2  LAIL-PZ2.54-3P-L  [HDR-TH_3P-P2.54-V-M-1]  65 2 180 bottom
LED7  XL-2012UGC  [LED0805-RD_GREEN]  21.28 27.49 180 top
NOREF  -  [Pad_e15]  5.66 15.05 0 top
NOREF#2  -  [Pad_e14]  5.66 17.71 0 top
Q11  MMBT3904TT1G  [SC-75-3_L1.6-W0.8-P1.00-LS1.6-BR]  17.47 24.19 0 top
Q12  AO3401A  [SOT-23_L2.9-W1.3-P1.90-LS2.4-BR]  14.81 25.97 180 top
R1  1kΩ  [R0603]  21.41 23.43 180 top
R2  1kΩ  [R0603]  17.98 26.73 90 top
R49  10kΩ  [R0603]  5.79 4.51 0 bottom
R57  10kΩ  [R0603]  5.79 6.28 0 bottom
R61  10kΩ  [R0603]  4.9 11.87 90 bottom
R63  10kΩ  [R0603]  5.79 7.94 0 bottom
R64  10kΩ  [R0603]  5.79 9.59 180 bottom
R75  10kΩ  [R0603]  20.4 14.79 180 bottom
R78  10kΩ  [R0603]  28.01 23.3 0 top
R79  10kΩ  [R0603]  14.3 23.43 180 top
R80  10kΩ  [R0603]  36.52 8.32 0 top
R83  10kΩ  [R0603]  36.52 6.67 0 top
R84  10kΩ  [R0603]  38.18 2.73 0 bottom
R85  10kΩ  [R0603]  35.77 1.97 270 bottom
R86  10kΩ  [R0603]  38.18 1.2 0 bottom
R87  10kΩ  [R0603]  36.52 4.63 0 bottom
R89  10kΩ  [R0603]  38.18 9.84 0 top
R90  10kΩ  [R0603]  40.33 9.08 90 top
RAIN1  PM254-1-04-W-8.5  [HDR-TH_4P-P2.54-H-F-W10.0-N]  57.86 36 270 top
SIGS1  LAIL-PZ2.54-3P-L  [HDR-TH_3P-P2.54-V-M-1]  5 2 180 bottom
SOIL1  LAIL-PZ2.54-3P-L  [HDR-TH_3P-P2.54-V-M-1]  65.73 20.13 180 top
VCC1  LAIL-PZ2.54-3P-L  [HDR-TH_3P-P2.54-V-M-1]  2 35 270 bottom

## Footprints (pads in the part's own frame, mm; a bottom-side part is the same pattern mirrored in y, then rotated)
C0603
  rect 0.8x0.9 smd: 1(-0.7,0) 2(0.7,0)
C1206
  rect 1.485x1.728 smd: 1(-1.593,0) 2(1.593,0)
HDR-TH_3P-P2.54-V-M-1
  rect 1.575x1.6 hole 1.1: 1(-2.54,0)
  round 1.6 hole 1.1: 2(0,0) 3(2.54,0)
HDR-TH_4P-P2.54-H-F-W10.0-N
  round 1.9 hole 1.1: 1(-3.81,0) 2(-1.27,0) 3(1.27,0) 4(3.81,0)
HDR-TH_8P-P2.54-V-F
  rect 1.575x1.7 hole 1.1: 1(-8.89,0)
  round 1.7 hole 1.1: 2(-6.35,0) 3(-3.81,0) 4(-1.27,0) 5(1.27,0) 6(3.81,0) 7(6.35,0) 8(8.89,0)
LED0805-RD_GREEN
  rect 1x1.25 smd: 1(-1.1,0) 2(1.1,0)
Pad_e14
  round 1.524 hole 0.914: 1(0,0)
Pad_e15
  round 1.524 hole 0.914: 2(0,0)
R0603
  rect 0.806x0.864 smd: 1(-0.753,0) 2(0.753,0)
SC-75-3_L1.6-W0.8-P1.00-LS1.6-BR
  rect 0.816x0.4 smd: 1(0.65,-0.5) 2(0.65,0.5) 3(-0.65,0)
SOT-23_L2.9-W1.3-P1.90-LS2.4-BR
  rect 1x0.8 smd: 1(1.15,-0.95) 2(1.15,0.95) 3(-1.15,0)

## Nets
As in the schematic, except:
RX: C29.5 NOREF#2.1
TX: C29.4 NOREF.2

Pads without a net: C28 6 7; RAIN1 2

## Via types
v1: diameter 0.61, hole 0.305, Top Layer to Bottom Layer, 13 vias

## Routing (per net, layer and track width the routed paths; a pad name or vN(x,y) marks a point on that pad's centre or on a via; arc(x,y) is an arc through that point)
GND: length 0.8
  Bottom Layer w0.254: 67.38,34.48 66.62,34.48
  vias: v1(1.47,24.83) v1(1.47,20) v1(22.68,13.4) v1(27.51,13.4) v1(33.86,1.2) v1(41.73,14.41) v1(43,6.54) v1(48.84,19.24) v1(48.84,14.41) v1(50.49,34.99) v1(54.05,22.92) v1(60.27,6.83) v1(67.38,6.83)
CTR-PWR: length 59.1
  Top Layer w0.7: 16,26.01 53.2,26.01
  Top Layer w1: 57.86,30.67 53.2,26.01 59.6,26.01 62.81,22.79 ; 62.81,22.79 65.48,20.13 SOIL1.2 ; 62.81,22.79 DHT1.1
DHT: length 51.6
  Bottom Layer w0.7: 21.28,14.67 24.24,14.67 C28.8
  Bottom Layer w1: C28.8 36.94,27.37 61.16,27.37 DHT1.2
PUMP: length 52
  Bottom Layer w0.254: C28.5 22.33,12.22 20.4,14.16 20.4,17.84 16.33,21.91 4.27,21.91 2.49,20.13 2.49,2.03 SIGS1.3
RAIN: length 3.8
  Bottom Layer w1: C36.1 32.01,2.73 R85.1
RX: length 8.1
  Top Layer w1.5: C29.5 6.04,17.71 NOREF#2.1
SENSOR-POW: length 30.3
  Top Layer w1: 22.16,23.04 13.01,13.88 13.01,4.01 11.5,2.51 C29.1 ; 22.29,23.3 R78.1
SERVO: length 6.8
  Top Layer w1: SIGS1.1 7.54,3.21 C29.3
SOLAR-IN: length 2.5
  Bottom Layer w1: R49.1 5,4.47 SIGS1.2
SOLAR-PRS: length 13.1
  Bottom Layer w0.7: R61.1 9.04,11.12 C37.1 9.09,7.05 11.5,4.63 ; R64.2 5.04,10.84 ; 4.83,11.05 4.77,11.11
TX: length 8.1
  Top Layer w1.5: 11.5,9.71 11,9.71 NOREF.2
$1N3086: length 1.8
  Bottom Layer w1: R57.2 R49.2
$1N3441: length 1.7
  Bottom Layer w1: R64.1 R63.2
$1N3489: length 1.7
  Bottom Layer w1: R63.1 R57.1
$1N5191: length 7.9
  Bottom Layer w0.7: 19.39,14.79 C29.6
$1N5883: length 3.1
  Top Layer w0.5: 20.78,23.3 20.4,23.68 17.88,23.68
$1N5886: length 4.1
  Top Layer w0.5: R79.1 15.05,25.52 13.66,26.92
$1N6540: length 63.2
  Bottom Layer w0.5: R86.2 52.02,1.2 67,16.19 67,30.8 57.99,39.81
  Bottom Layer w1: R86.2 R84.2
$1N8994: length 28.5
  Top Layer w1: R89.2 40.33,9.84 R90.2 52.9,9.83 SOIL1.3
$1N9001: length 2.3
  Top Layer w1: LED7.2 18.1,27.49 17.98,27.61

## Copper pours and planes (outline as drawn; the poured copper is in the pictures)
GND on Top Layer: -1.87,42 71.7,42 71.7,-2.35 -1.87,-2.35
GND on Bottom Layer: -2.08,42.86 70.94,42.86 70.94,-1.34 -2.08,-1.34
VIN on Top Layer: 0.5,38.81 0.69,39 3.5,39 3.5,34.86 12.71,25.65 14.04,25.65 14.04,19.52 13.52,19.01 10.11,19.01 10.11,20.76 7.57,20.76 7.49,20.84 7.49,21.96 6.75,22.69 5.33,22.69 0.46,27.57 0.46,29.27 0.5,29.31
CTR-PWR on Top Layer: 56.84,32.83 57.16,33.14 58.56,33.14 59,32.7 59,27.37 60.6,25.77 52.11,25.77 51.87,26.01 52.31,26.01 56.84,30.54
RAIN on Bottom Layer: 28.52,2.86 29.03,3.36 32.59,3.36 32.66,3.29 32.66,2.25 32.38,1.97 31.12,1.97 30.36,1.2 28.65,1.2 28.52,1.33
RAIN on Bottom Layer: 36.52,5.52 36.52,2.33 36.17,1.97 31.51,1.97 31.24,2.25 31.24,3.06 31.19,3.11 31.44,3.36 32.71,3.36 34.87,5.52
RAIN on Bottom Layer: 31.33,1.97 31.33,2.34 34.45,5.46 36.52,5.46 36.52,2.33 36.17,1.97 31.34,1.97
SOIL on Top Layer: 28.57,3.82 28.57,5.39 30.17,5.39 30.3,5.27 32.78,5.27 33.03,5.52 33.03,7.15 35,9.12 36.52,9.12 36.52,5.71 34.68,5.71 32.59,3.62 28.78,3.62
SOLAR-PRS on Bottom Layer: 9.49,11.61 9.49,7.08 8.71,7.08 8.71,9.08 6.93,10.86 5.56,10.86 5.56,11.45 5.72,11.61
$1N5886 on Top Layer: 14.55,25.9 14.93,25.9 16.38,24.44 17.35,24.44 17.35,24.07 16.25,22.92 14.55,22.92
$1N6540 on Bottom Layer: 38.46,0.75 38.43,0.79 38.43,3.24 38.58,3.39 39.56,3.39 41.55,1.4 40.9,0.75
$1N8864 on Bottom Layer: 36.78,5.52 37.85,5.52 38.05,5.33 38.05,0.7 37.9,0.54 36.78,0.54
$1N9000 on Top Layer: 36.79,10.5 37.75,10.5 38.43,9.82 38.43,9.08 38.68,8.82 39.57,8.82 39.7,8.95 40.84,8.95 40.99,8.8 40.99,7.69 36.79,7.69 36.79,7.7

Small or netless copper shapes (teardrops, artwork), in the pictures only: 1 on Bottom Layer

## Text on the board
Top Silkscreen Layer: SERVO | SENPOW | SOLAR | OLEDSDA | OLEDSCL | PUMP | RAIN | SOIL | NAH | DHT | GND | VCC | SIG | 10kΩ | RX | TX | PIN / ELECT

# Board PCB4
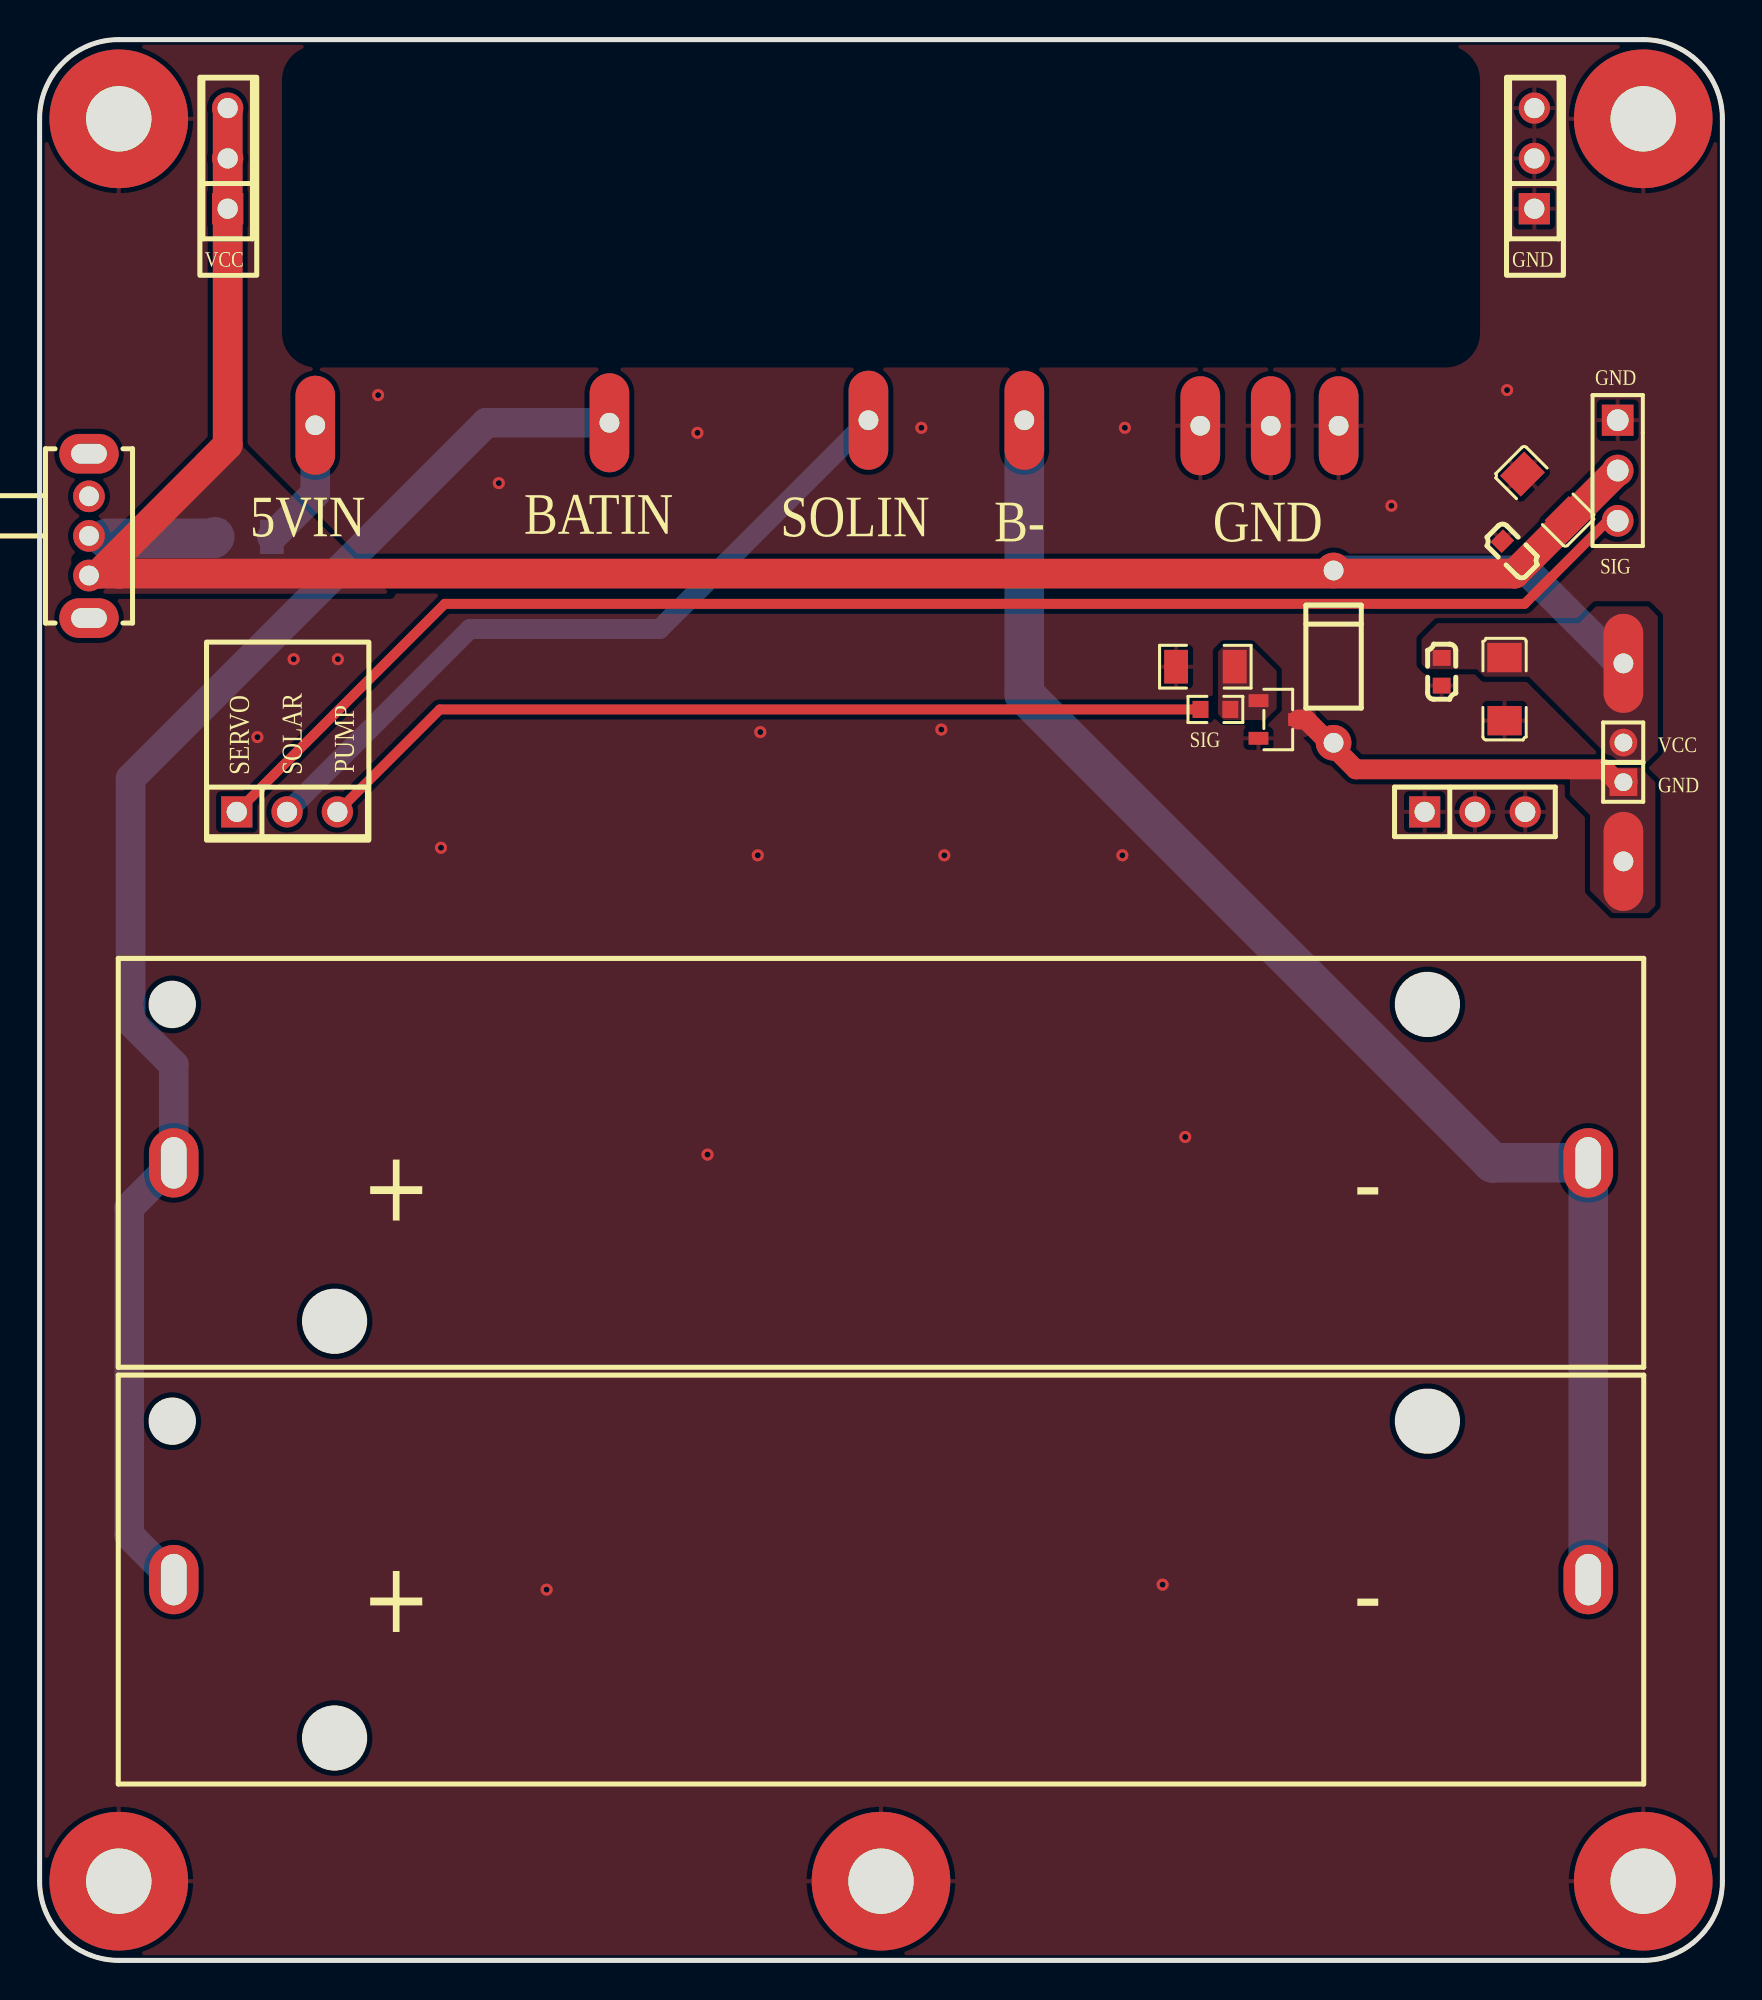
[diagram p4: board, top side]
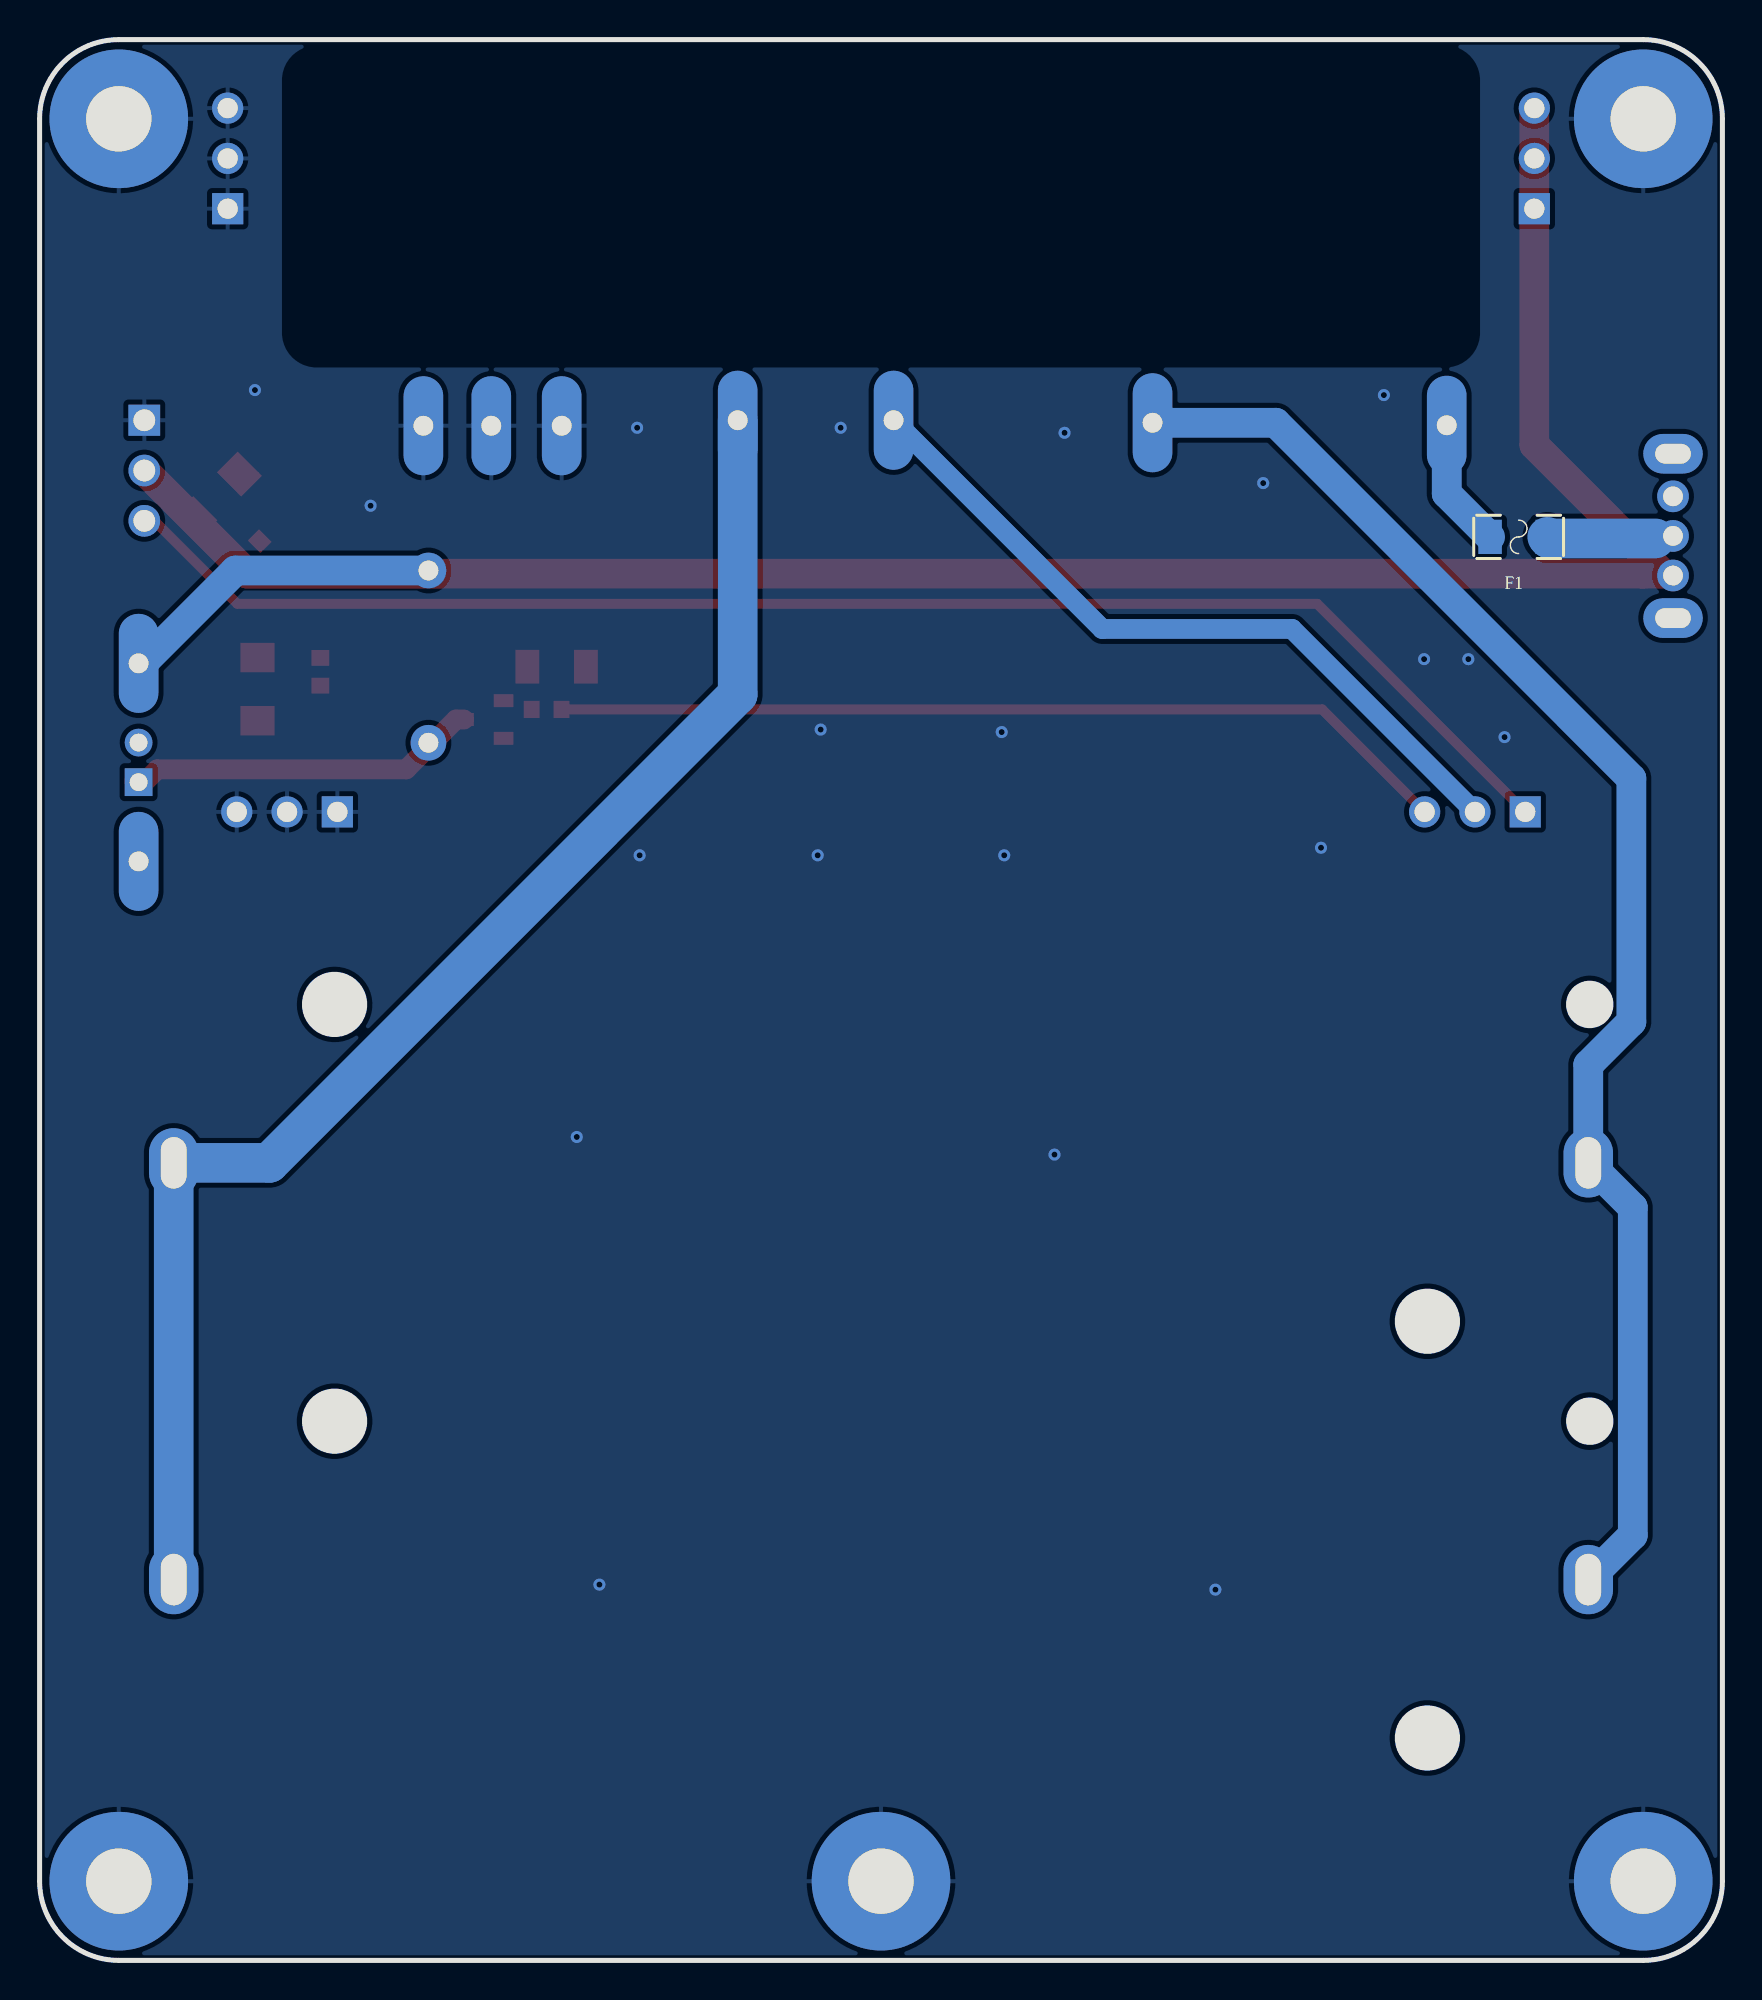
[diagram p5: board, bottom side, seen from below]

Outline 85 x 97 mm; copper layers: Top Layer, Bottom Layer. Coordinates in mm from the lower left corner of the outline.
Outline path: 0,93 0,4 arc(1.17,1.17) 4,0 81,0 arc(83.83,1.17) 85,4 85,93 arc(83.83,95.83) 81,97 4,97 arc(1.17,95.83) 0,93
Stack: Top Layer 0.035mm / Dielectric1 1.51mm FR4 er 4.5 / Bottom Layer 0.035mm

## Design rules (mm)
spacing copperThickness1oz (default): track to track 0.102, other pairs 0.152 to 0.3
spacing copperThickness2oz: track to track 0.203, other pairs 0.152 to 0.3
spacing Plane_innerPlane: track to track 0.102, other pairs 0.152 to 0.3
spacing Copper_copperRegion: track to track 0.102, other pairs 0.152 to 0.3
spacing Copper_copperRegion1: track to track 0.102, other pairs 0.152 to 0.3
spacing Copper_copperRegion_copperThickness1oz: track to track 0.102, other pairs 0.152 to 0.3
spacing Copper_copperRegion_Copper_copperRegion1: track to track 0.102, other pairs 0.152 to 0.3
spacing Copper_copperRegion_Copper_copperRegion: track to track 0.102, other pairs 0.152 to 0.3
track width copperThickness1oz (default): min 0.127, default 0.254, max 2.54
track width copperThickness2oz: min 0.203, default 0.254, max 2.54
differential pair differentialPair (default): width min 0.127, default 0.254, max 2.54; gap min 0.152, default 0.152
via viaSize (default): diameter min 0.5, default 0.61, max 10; hole min 0.3, default 0.305, max 6.3
net GND uses copperRegion_copperThickness1oz
net VIN uses copperRegion1_copperThickness1oz
net $1N2742 uses copperRegion1_copperThickness1oz
net $1N2960 uses copperRegion1_copperThickness1oz
pour e50 uses Copper_copperRegion_Copper_copperRegion1, copperRegion1_Copper_copperRegion_Copper_copperRegion1
pour e52 uses Copper_copperRegion1, copperRegion_Copper_copperRegion1
pour e186 uses Copper_copperRegion1, copperRegion_Copper_copperRegion1_1
pour e194 uses Copper_copperRegion1, copperRegion_Copper_copperRegion1_1
pour e200 uses Copper_copperRegion_copperThickness1oz, copperRegion_Copper_copperRegion_copperThickness1oz
pour e270 uses Copper_copperRegion_copperThickness1oz, copperRegion_Copper_copperRegion_copperThickness1oz

## Placement (name value [footprint] x y rotation side)
C1  100nF  [C0603]  70.82 65.08 90 top
C2  100nF  [C0603]  74.38 71.17 315 top
C12  100uF  [C1206]  74 64.2 90 top
C31  100uF  [C1206]  76.03 73.93 315 top
D3  1N4007RLG  [DO-41_BD2.4-L4.7-P8.70-D0.9-RD]  65.36 65.84 270 top
F1  SMD1206-300-6  [F1206]  10.29 71.89 0 bottom
GND1  LAIL-PM2.54-3P-L  [HDR-TH_3P-P2.54-V-F]  75.5 91 90 top
GND2  LAIL-PM2.54-3P-L  [HDR-TH_3P-P2.54-V-F]  72.5 58 0 top
H3  PZ200V-11-02P  [HDR-TH_2P-P2.00-V-M]  80 60.5 90 top
NOREF  -  [Pad_e9]  49.74 77.78 0 top
NOREF#2  -  [Pad_e13]  42.5 4 0 top
NOREF#3  -  [Pad_e14]  81 4 0 top
NOREF#4  -  [Pad_e11]  81 93 0 top
NOREF#5  -  [Pad_e4]  62.19 77.5 0 top
NOREF#6  -  [Pad_e8]  80 65.5 180 top
NOREF#7  -  [Pad_e12]  4 4 0 top
NOREF#8  -  [Pad_e7]  80 55.5 0 top
NOREF#9  -  [Pad_e5]  58.63 77.5 0 top
NOREF#10  -  [Pad_e3]  65.61 77.5 0 top
NOREF#11  -  [Pad_e6]  41.87 77.78 0 top
NOREF#12  -  [Pad_e1]  28.78 77.65 0 top
NOREF#13  -  [Pad_e10]  4 93 0 top
NOREF#14  -  [Pad_e2]  13.92 77.52 0 top
Q7  AO3400A  [SOT-23-3_L2.9-W1.3-P1.90-LS2.4-BR]  62.57 62.67 180 top
R1  1kΩ  [R0603]  59.39 63.17 180 top
R17  10kΩ  [R1206]  58.88 65.33 0 top
SERVO1  LAIL-PZ2.54-3P-L  [HDR-TH_3P-P2.54-V-M-1]  79.71 75.24 270 top
SIGS2  LAIL-PM2.54-3P-L  [HDR-TH_3P-P2.54-V-F]  12.5 58 0 top
SW1  SK12D07VG5  [SW-TH_SK12D07VG5-1]  2.5 71.94 270 top
U1  BH-18650-A6AJ012  [BAT-TH_BH-18650-A6AJ012]  42.5 40.28 180 top
U2  BH-18650-A6AJ012  [BAT-TH_BH-18650-A6AJ012]  42.5 19.23 180 top
VCC1  LAIL-PM2.54-3P-L  [HDR-TH_3P-P2.54-V-F]  9.5 91 90 top

## Footprints (pads in the part's own frame, mm; a bottom-side part is the same pattern mirrored in y, then rotated)
BAT-TH_BH-18650-A6AJ012
  oval 2.5x3.5 hole 1.3x2.6: 1(-35.725,0) 2(35.725,0)
C0603
  rect 0.8x0.9 smd: 1(-0.7,0) 2(0.7,0)
C1206
  rect 1.485x1.728 smd: 1(-1.593,0) 2(1.593,0)
DO-41_BD2.4-L4.7-P8.70-D0.9-RD
  round 1.8 hole 1: 1(-4.35,0) 2(4.35,0)
F1206
  rect 1.19x1.728 smd: 1(-1.445,0) 2(1.445,0)
HDR-TH_2P-P2.00-V-M
  rect 1.4x1.4 hole 0.9: 1(-1,0)
  round 1.4 hole 0.9: 2(1,0)
HDR-TH_3P-P2.54-V-F
  rect 1.575x1.575 hole 1.02: 1(-2.54,0)
  round 1.575 hole 1.02: 2(0,0) 3(2.54,0)
HDR-TH_3P-P2.54-V-M-1
  rect 1.575x1.6 hole 1.1: 1(-2.54,0)
  round 1.6 hole 1.1: 2(0,0) 3(2.54,0)
Pad_e1
  oval 2x5 hole 1: 1(0,0)
Pad_e2
  oval 2x5 hole 1: 1(0,0)
Pad_e3
  oval 2x5 hole 1: 1(0,0)
Pad_e4
  oval 2x5 hole 1: 1(0,0)
Pad_e5
  oval 2x5 hole 1: 1(0,0)
Pad_e6
  oval 2x5 hole 1: 1(0,0)
Pad_e7
  oval 2x5 hole 1: 1(0,0)
Pad_e8
  oval 2x5 hole 1: 1(0,0)
Pad_e9
  oval 2x5 hole 1: 1(0,0)
Pad_e10
  round 7 hole 3.3: 1(0,0)
Pad_e11
  round 7 hole 3.3: 1(0,0)
Pad_e12
  round 7 hole 3.3: 1(0,0)
Pad_e13
  round 7 hole 3.3: 1(0,0)
Pad_e14
  round 7 hole 3.3: 1(0,0)
R0603
  rect 0.806x0.864 smd: 1(-0.753,0) 2(0.753,0)
R1206
  rect 1.208x1.701 smd: 1(-1.479,0) 2(1.479,0)
SOT-23-3_L2.9-W1.3-P1.90-LS2.4-BR
  rect 1x0.65 smd: 1(1,-0.95) 2(1,0.95) 3(-1,0)
SW-TH_SK12D07VG5-1
  oval 1.6x1.6 hole 1: 1(-2,0) 2(0,0) 3(2,0)
  oval 2x3 hole 1x1.8: 4(4.15,0) 5(-4.15,0)

## Nets
GND: C1.1 C2.1 C12.1 C31.1 GND1.1 GND1.2 GND1.3 GND2.1 GND2.2 GND2.3 NOREF#2.1 NOREF#3.1 NOREF#4.1 NOREF#5.1 NOREF#7.1 NOREF#9.1 NOREF#10.1 NOREF#13.1 Q7.2 R17.1 SERVO1.1
V5V: F1.2 NOREF#14.1
VIN: C1.2 C2.2 C12.2 C31.2 D3.1 H3.2 NOREF#6.1 SERVO1.2 SW1.3 VCC1.1 VCC1.2 VCC1.3
B-: NOREF.1 U1.1 U2.1
BATIN: NOREF#12.1 U1.2 U2.2
PUMP: R1.2 SIGS2.3
SERVO: SERVO1.3 SIGS2.1
SOLAR-IN: NOREF#11.1 SIGS2.2
$1N1444: F1.1 SW1.2
$1N2742: D3.2 H3.1 NOREF#8.1 Q7.3
$1N2960: Q7.1 R1.1 R17.2

Pads without a net: SW1 1 4 5

## Via types
v1: diameter 0.61, hole 0.305, Top Layer to Bottom Layer, 20 vias

## Routing (per net, layer and track width the routed paths; a pad name or vN(x,y) marks a point on that pad's centre or on a via; arc(x,y) is an arc through that point)
GND:
  vias: v1(11,61.78) v1(12.83,65.71) v1(15.07,65.71) v1(17.1,79.05) v1(20.28,56.19) v1(23.2,74.6) v1(25.61,18.72) v1(33.23,77.14) v1(33.74,40.69) v1(36.28,55.81) v1(36.4,62.03) v1(44.54,77.4) v1(45.55,62.16) v1(45.7,55.81) v1(54.69,55.81) v1(54.82,77.4) v1(56.72,18.98) v1(57.87,41.58) v1(68.28,73.46) v1(74.12,79.3)
V5V: length 6.5
  Bottom Layer w1.5: F1.2 13.92,74.08 NOREF#14.1
VIN: length 122.4
  Top Layer w1.5: 4.04,70.03 74.5,70.03 SERVO1.2 ; 4.04,70.03 3.4,70.09 ; 4.04,70.03 3,70.03 9.5,76.53 VCC1.1 VCC1.2 VCC1.3
  Bottom Layer w1.5: D3.1 75.11,70.19 79.58,65.71 80.22,65.71
B-: length 73.2
  Bottom Layer w2: NOREF.1 49.74,63.94 73.4,40.28 U1.1 U2.1
BATIN: length 74.8
  Bottom Layer w1.5: U2.2 4.53,21.48 4.53,38.03 U1.2 6.78,45.23 4.6,47.41 4.6,59.69 22.56,77.65 NOREF#12.1
PUMP: length 45.7
  Top Layer w0.5: R1.2 20.21,63.17 SIGS2.3
SERVO: length 75.8
  Top Layer w0.5: SERVO1.3 79.2,72.7 75.01,68.51 20.47,68.51 SIGS2.1
SOLAR-IN: length 37.6
  Bottom Layer w1: SIGS2.2 21.74,67.24 31.32,67.24 NOREF#11.1
$1N1444: length 5.5
  Bottom Layer w2: 8.84,71.89 8.77,71.81 3.38,71.81
$1N2742: length 17.9
  Top Layer w1: Q7.3 63.96,62.67 66.48,60.15 79.05,60.15 79.66,59.54 80.22,59.54

## Copper pours and planes (outline as drawn; the poured copper is in the pictures)
GND on Top Layer: -11.6,106.86 132.16,106.86 132.16,-15.82 -11.6,-15.82
GND on Bottom Layer: -11.98,105.72 86.19,105.72 86.19,-1.47 -11.98,-1.47
VIN on Top Layer: 69.81,66.73 70.61,67.53 77.76,67.53 78.61,68.38 81.24,68.38 81.74,67.87 81.74,61.06 81.22,60.54 79.51,60.54 75.22,64.82 72.98,64.82 72.6,65.2 70.06,65.2 69.81,65.46
VIN on Top Layer: 1.86,70.79 2.75,70.79 8.84,76.89 9.83,76.89 17.71,69.02 1.86,69.02
$1N2742 on Top Layer: 78.19,59.74 78.69,60.24 80.86,60.24 81.62,59.49 81.62,53.27 81.24,52.89 79.46,52.89 78.31,54.03 78.31,57.84 77.3,58.86 77.3,59.87 77.43,59.74
$1N2960 on Top Layer: 59.83,66.41 61.19,66.41 61.19,66.41 62.49,65.12 62.49,63.22 61.8,62.54 61.7,62.64 59.82,62.64 59.52,62.94 59.52,66.09 59.83,66.41

## Text on the board
Top Silkscreen Layer: VCC | SIG | GND | SERVO | SOLAR | PUMP | 5VIN | BATIN | SOLIN | B- | + | -
